# Altium project lga1700.PrjPCB (part 3 of 11)

## Sheet AUDIO - ALC897_3CH.schdoc
size 594 x 421 mm; Symbol: Sheet-Symbol_A2; Company: 嘉立创EDA; Version: V1.0; Page Size: A2; @Project Name: H610(2024/12/09); @Page Count: 36; @Update Date: 2025-10-09; @Create Date: 2025-10-09; @Schematic Name: SCHEMATIC1; @Page No: 20; @Page Name: AUDIO - ALC897_3CH; Device: Sheet-Symbol_A2; @Board Name: SCHEMATIC1; @Create Time: 10:15:41; @Update Time: 10:39:12
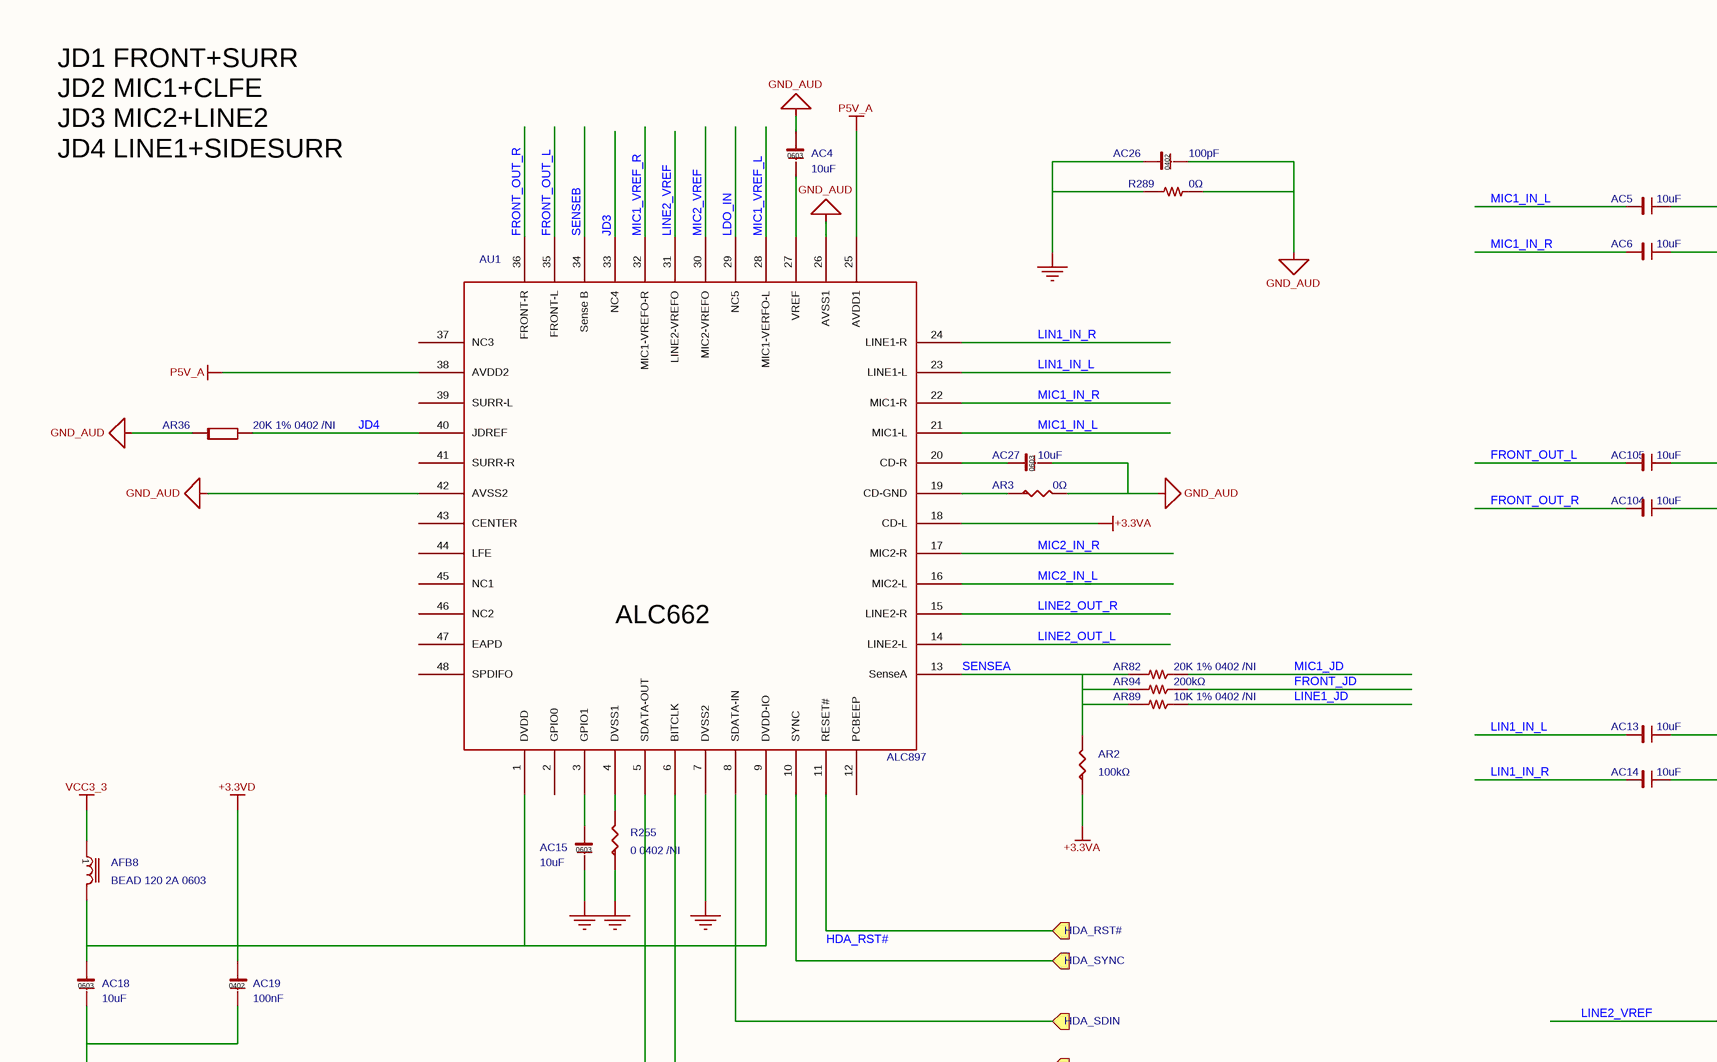
[diagram p7: AUDIO - ALC897_3CH.schdoc, top left]
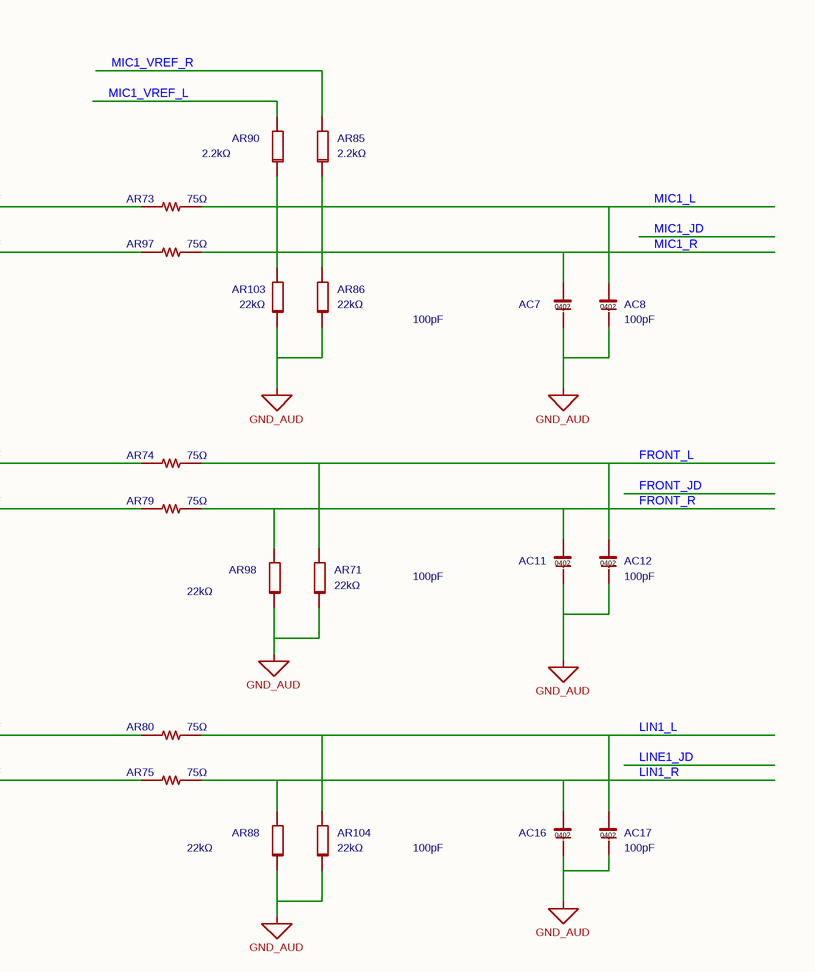
[diagram p8: AUDIO - ALC897_3CH.schdoc, top right]
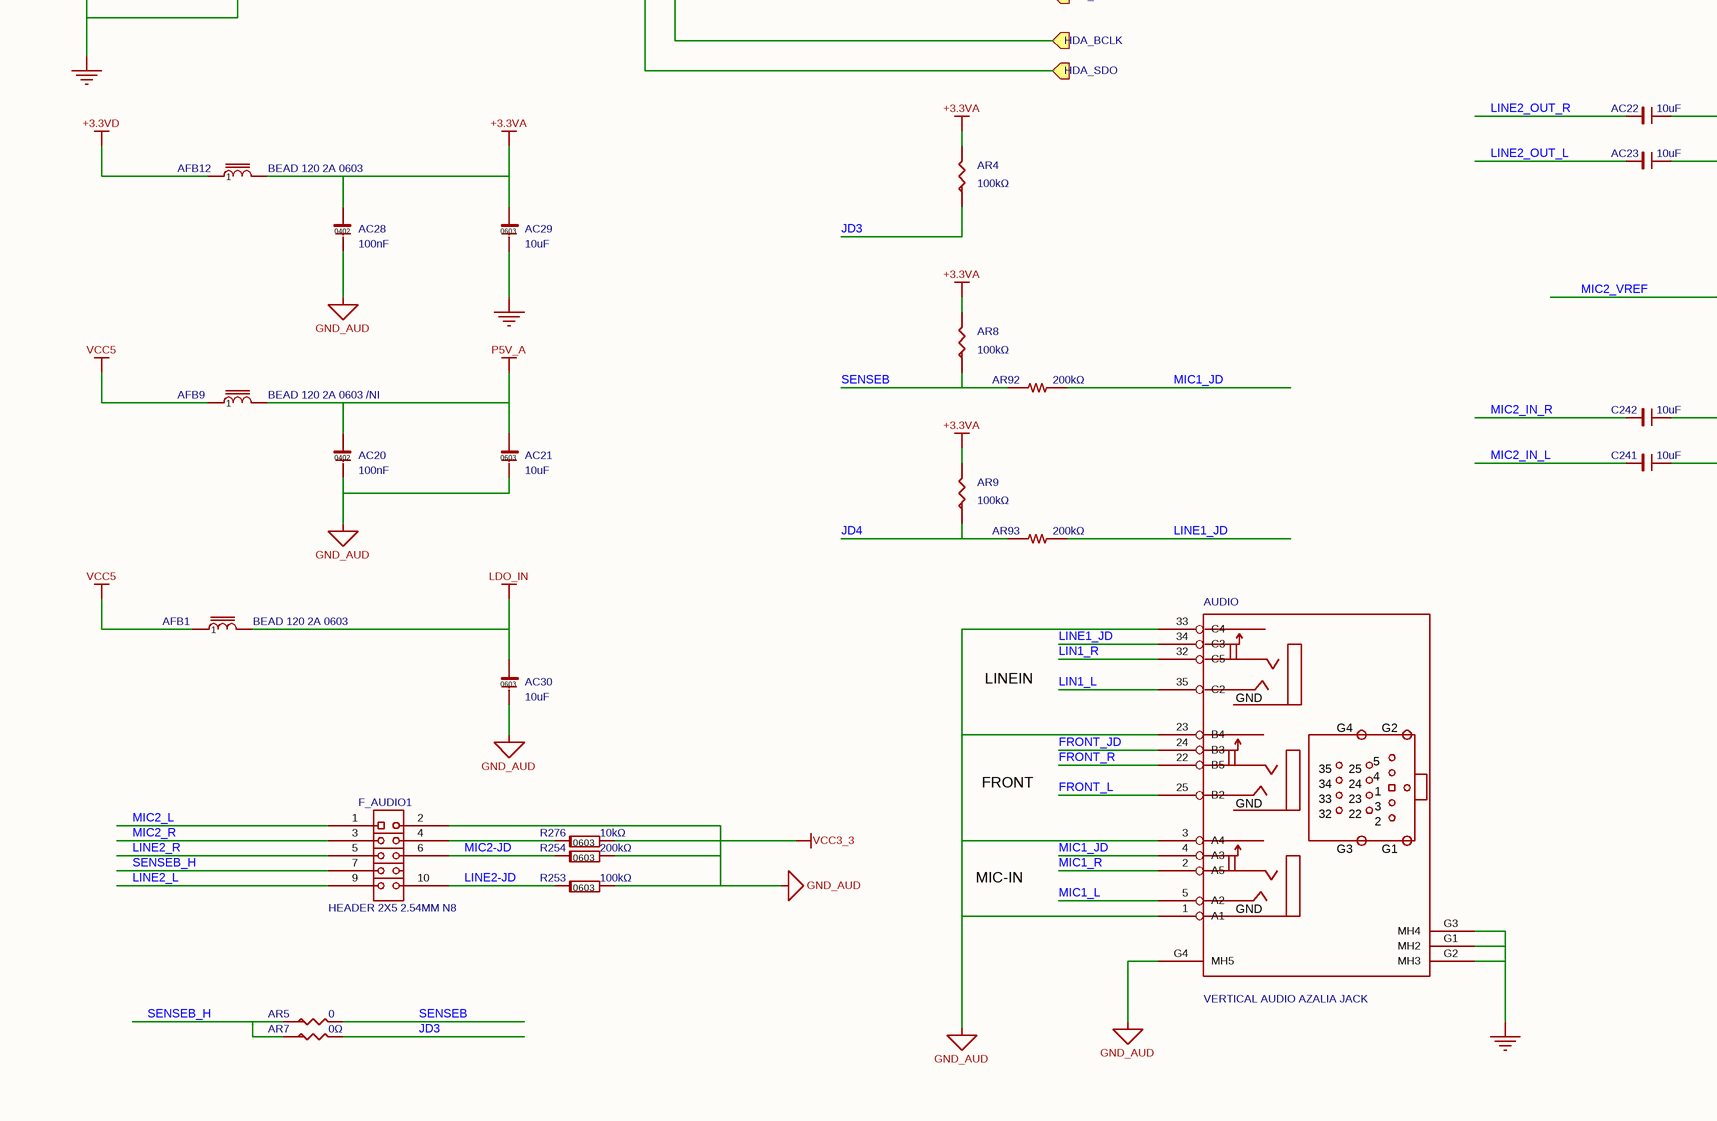
[diagram p9: AUDIO - ALC897_3CH.schdoc, bottom left]
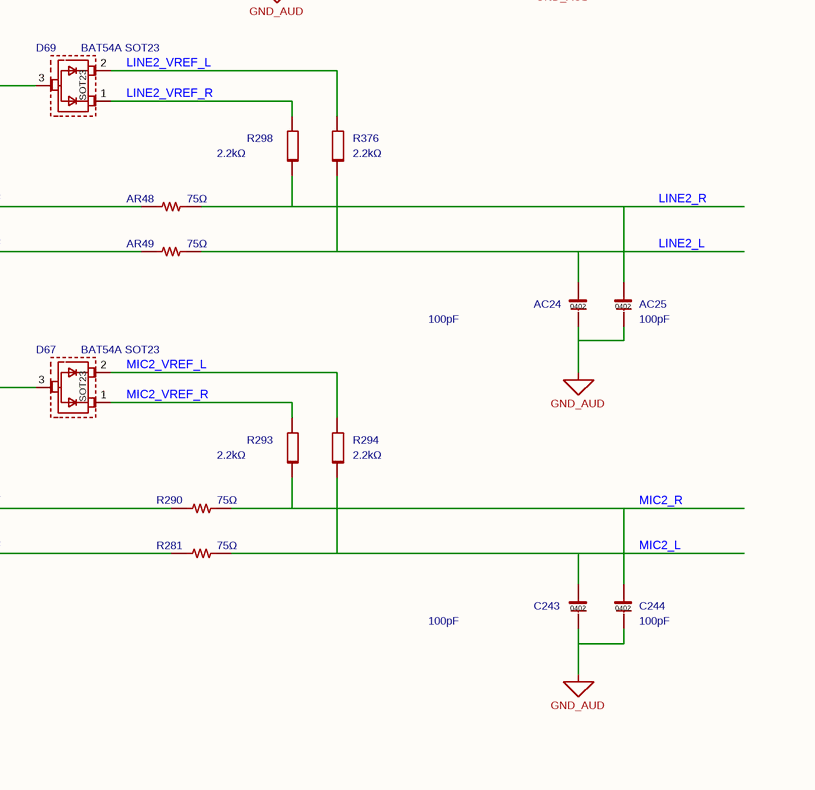
[diagram p10: AUDIO - ALC897_3CH.schdoc, bottom right]

### Parts
AC4  10uF  [C0603]
AC5  10uF  [C0603_1]
AC6  10uF  [C0603_1]
AC7  100pF  [C0402]
AC8  100pF  [C0402_1]
AC11  100pF  [C0402_1]
AC12  100pF  [C0402_1]
AC13  10uF  [C0603_1]
AC14  10uF  [C0603_1]
AC15  10uF  [C0603]
AC16  100pF  [C0402_1]
AC17  100pF  [C0402_1]
AC18  10uF  [C0603]
AC19  100nF  [C0402]
AC20  100nF  [C0402_2]
AC21  10uF  [C0603_2]
AC22  10uF  [C0603_1]
AC23  10uF  [C0603_1]
AC24  100pF  [C0402_2]
AC25  100pF  [C0402_2]
AC26  100pF  [C0402_2]
AC27  10uF  [C0603_1]
AC28  100nF  [C0402_2]
AC29  10uF  [C0603_1]
AC30  10uF  [C0603_3]
AC104  10uF  [C0603_3]
AC105  10uF  [C0603_3]
AFB1  value BEAD 120 2A 0603  [FB0603_2]  (hidden comment: FERRITE BEAD)
AFB8  value BEAD 120 2A 0603  [FB0603]  (hidden comment: FERRITE BEAD)
AFB9  value BEAD 120 2A 0603 /NI  [FB0603_1]  (hidden comment: FERRITE BEAD)
AFB12  value BEAD 120 2A 0603  [FB0603_2]  (hidden comment: FERRITE BEAD)
AR2  100kΩ  [R0402]
AR3  0Ω  [R0402_1]
AR4  100kΩ  [R0402_2]
AR5  value 0  [R0402_2]  (hidden comment: RESISTOR)
AR7  0Ω  [R0402]
AR8  100kΩ  [R0402]
AR9  100kΩ  [R0402_3]
AR36  value 20K 1% 0402 /NI  [R0402_1]  (hidden comment: R0402)
AR48  75Ω  [R0402_3]
AR49  75Ω  [R0402_3]
AR71  22kΩ  [R0402_1]
AR73  75Ω  [R0402_2]
AR74  75Ω  [R0402_3]
AR75  75Ω  [R0402_3]
AR79  75Ω  [R0402_3]
AR80  75Ω  [R0402_3]
AR82  value 20K 1% 0402 /NI  [R0402_2]  (hidden comment: 10_R_0)
AR85  2.2kΩ  [R0402_2]
AR86  22kΩ  [R0402]
AR88  22kΩ  [R0402_1]
AR89  value 10K 1% 0402 /NI  [R0402_2]  (hidden comment: 10_R_0)
AR90  2.2kΩ  [R0402_2]
AR92  200kΩ  [R0402_2]
AR93  200kΩ  [R0402_3]
AR94  200kΩ  [R0402_2]
AR97  75Ω  [R0402_2]
AR98  22kΩ  [R0402_1]
AR103  22kΩ  [R0402_2]
AR104  22kΩ  [R0402_1]
AU1  value ALC897  [LQFP48]  (hidden comment: ALC662_1)
AUDIO  value VERTICAL AUDIO AZALIA JACK  [AUDIO_V]  (hidden comment: ABA-JAK-027-K24)
C241  10uF  [C0603_1]
C242  10uF  [C0603_1]
C243  100pF  [C0402_2]
C244  100pF  [C0402_2]
D67  value BAT54A SOT23  [SOT23_124]  (hidden comment: BAT54A)
D69  value BAT54A SOT23  [SOT23_124]  (hidden comment: BAT54A)
F_AUDIO1  value HEADER 2X5 2.54MM N8  [PIN2X5_2D54_NC8]  (hidden comment: 210-82-05GB06)
R253  100kΩ  [R0402_1]
R254  200kΩ  [R0402_1]
R255  value 0 0402 /NI  [R0402]  (hidden comment: R)
R276  10kΩ  [R0402_1]
R281  75Ω  [R0402_3]
R289  0Ω  [R0603_2]
R290  75Ω  [R0402_3]
R293  2.2kΩ  [R0402]
R294  2.2kΩ  [R0402]
R298  2.2kΩ  [R0402]
R376  2.2kΩ  [R0402]

### Ports
HDA_BCLK (in), HDA_RST# (in), HDA_SDIN (in), HDA_SDO (in), HDA_SYNC (in)

### Nets
+3.3VA: AC28.1 AC29.1 AFB12.2 AR2.1 AR4.2 AR8.2 AR9.2 AU1.18(CD-L)
+3.3VD: AC18.1 AC19.1 AFB8.2 AFB12.1 AU1.1(DVDD) AU1.9(DVDD-IO)
GND: AC15.2 AC18.2 AC19.2 AC26.1 AC29.2 AU1.7(DVSS2) AUDIO.G1(MH2) AUDIO.G2(MH3) AUDIO.G3(MH4) R255.1 R289.1
GND_AUD: AC4.1 AC7.2 AC8.2 AC11.2 AC12.2 AC16.2 AC17.2 AC20.2 AC21.2 AC24.2 AC25.2 AC26.2 AC27.2 AC28.2 AC30.2 AR3.2 AR36.1 AR71.1 AR86.1 AR88.1 AR98.1 AR103.1 AR104.1 AU1.26(AVSS1) AU1.42(AVSS2) AUDIO.1(A1) AUDIO.3(A4) AUDIO.23(B4) AUDIO.33(C4) AUDIO.G4(MH5) C243.2 C244.2 F_AUDIO1.2 R253.2 R254.2 R289.2
LDO_IN: AC30.1 AFB1.2 AU1.29(NC5)
P5V_A: AC20.1 AC21.1 AFB9.2 AU1.25(AVDD1) AU1.38(AVDD2)
VCC3_3: AFB8.1 R276.2
VCC5: AFB1.1 AFB9.1
FRONT_JD: AR94.2 AUDIO.24(B3)
FRONT_L: AC12.1 AR71.2 AR74.1 AUDIO.25(B2)
FRONT_OUT_L: AC105.1 AU1.35(FRONT-L)
FRONT_OUT_R: AC104.1 AU1.36(FRONT-R)
FRONT_R: AC11.1 AR79.1 AR98.2 AUDIO.22(B5)
HDA_RST#: AU1.11(RESET#) ; port HDA_RST#
JD3: AR4.1 AR7.2 AU1.33(NC4)
JD4: AR9.1 AR36.2 AR93.1 AU1.40(JDREF)
LIN1_IN_L: AC13.1 AU1.23(LINE1-L)
LIN1_IN_R: AC14.1 AU1.24(LINE1-R)
LIN1_L: AC17.1 AR80.1 AR104.2 AUDIO.35(C2)
LIN1_R: AC16.1 AR75.1 AR88.2 AUDIO.32(C5)
LINE1_JD: AR89.2 AR93.2 AUDIO.34(C3)
LINE2-JD: F_AUDIO1.10 R253.1
LINE2_L: AC24.1 AR49.1 F_AUDIO1.9 R376.1
LINE2_OUT_L: AC23.1 AU1.14(LINE2-L)
LINE2_OUT_R: AC22.1 AU1.15(LINE2-R)
LINE2_R: AC25.1 AR48.1 F_AUDIO1.5 R298.1
LINE2_VREF: AU1.31(LINE2-VREFO) D69.3
LINE2_VREF_L: D69.2 R376.2
LINE2_VREF_R: D69.1 R298.2
MIC1_IN_L: AC5.1 AU1.21(MIC1-L)
MIC1_IN_R: AC6.1 AU1.22(MIC1-R)
MIC1_JD: AR82.2 AR92.2 AUDIO.4(A3)
MIC1_L: AC8.1 AR73.1 AR90.1 AR103.2 AUDIO.5(A2)
MIC1_R: AC7.1 AR85.1 AR86.2 AR97.1 AUDIO.2(A5)
MIC1_VREF_L: AR90.2 AU1.28(MIC1-VERFO-L)
MIC1_VREF_R: AR85.2 AU1.32(MIC1-VREFO-R)
MIC2-JD: F_AUDIO1.6 R254.1
MIC2_IN_L: AU1.16(MIC2-L) C241.1
MIC2_IN_R: AU1.17(MIC2-R) C242.1
MIC2_L: C243.1 F_AUDIO1.1 R281.1 R294.1
MIC2_R: C244.1 F_AUDIO1.3 R290.1 R293.1
MIC2_VREF: AU1.30(MIC2-VREFO) D67.3
MIC2_VREF_L: D67.2 R294.2
MIC2_VREF_R: D67.1 R293.2
SENSEA: AR2.2 AR82.1 AR89.1 AR94.1 AU1.13(SenseA)
SENSEB: AR5.2 AR8.1 AR92.1 AU1.34(Sense_B)
SENSEB_H: AR5.1 AR7.1 F_AUDIO1.7
NetAC4_2: AC4.2 AU1.27(VREF)
NetAC5_2: AC5.2 AR73.2
NetAC6_2: AC6.2 AR97.2
NetAC13_2: AC13.2 AR80.2
NetAC14_2: AC14.2 AR75.2
NetAC15_1: AC15.1 AU1.3(GPIO1)
NetAC22_2: AC22.2 AR48.2
NetAC23_2: AC23.2 AR49.2
NetAC27_1: AC27.1 AU1.20(CD-R)
NetAC104_2: AC104.2 AR79.2
NetAC105_2: AC105.2 AR74.2
NetAR3_1: AR3.1 AU1.19(CD-GND)
NetAU1_4: AU1.4(DVSS1) R255.2
NetAU1_5: AU1.5(SDATA-OUT) ; port HDA_SDO
NetAU1_6: AU1.6(BITCLK) ; port HDA_BCLK
NetAU1_8: AU1.8(SDATA-IN) ; port HDA_SDIN
NetAU1_10: AU1.10(SYNC) ; port HDA_SYNC
NetC241_2: C241.2 R281.2
NetC242_2: C242.2 R290.2
NetF_AUDIO1_4: F_AUDIO1.4 R276.1

Not connected (* = marked no-connect by the designer): AU1 2(GPIO0) 12(PCBEEP) 37(NC3) 39(SURR-L) 41(SURR-R) 43(CENTER) 44(LFE) 45(NC1) 46(NC2) 47(EAPD) 48(SPDIFO)

### Notes on the sheet
- JD1 FRONT+SURR
  JD2 MIC1+CLFE
  JD3 MIC2+LINE2
  JD4 LINE1+SIDESURR
- LINEIN
- FRONT
- MIC-IN
- 更新日期
- 2025-10-09
- 原理图
- 图页
- SCHEMATIC1
- AUDIO - ALC897_3CH
- 创建日期
- 物料编码
- 审阅
- 绘制
- H610(2024/12/09)
- 版本
- V1.0
- 尺寸
- A2
- 页
- 20
- 嘉立创EDA
- 共
- 36
- (in symbol 0402WGF1002TCE) 0603
- (in symbol 0402WGF1003TCE) 0603
- (in symbol 0402WGF2003TCE) 0603
- (in symbol ABA-JAK-027-K24) GND
- (in symbol ALC662_1) ALC662
- (in symbol BAT54A_C727124) SOT23
- (in symbol CL05A106MQ5NUNC) 0603

### Library data of the parts
AC4 AC15 AC18 = CL05A106MQ5NUNC: 容值:10uF;精度:±20%;额定电压:6.3V;材质(温度系数):X5R;; Manufacturer: SAMSUNG(三星); ModelId: 36a51122f27c49738f86b3bfa98863e0; Tolerance: ±20%; AddInBom: yes; Voltage Rated: 6.3V; ModelName: C0402_L1.0-W0.5-H0.5; ModelTransform: 39.37,19.685,0,0,0,0,0,0,0; Temperature Coefficient: X5R; Device: CL05A106MQ5NUNC; Symbol: C0603; Value: 10uF; Supplier: LCSC; Datasheet: https://atta.szlcsc.com/upload/public/pdf/source/20220823/2B02EE04F8F211D38A52DCB16EB6BEBA.pdf; FootprintName: C0603; SupplierPart: C15525; ConvertToPcb: yes; LCSC Part Name: 10uF ±20% 6.3V; JLCPCB Part Class: Basic Part; ManufacturerPart: CL05A106MQ5NUNC; Supplier Footprint: 0402
AC5 AC6 AC13 AC14 AC22 AC23 AC104 AC105 C241 C242 = CL10A106KP8NNNC: 容值:10uF;精度:±10%;额定电压:10V;材质(温度系数):X5R;; Manufacturer: SAMSUNG(三星); Symbol: C0805; ModelId: ac125912035d415993ca9572d50418b1; Tolerance: ±10%; AddInBom: yes; Voltage Rated: 10V; ModelName: C0603_L1.6-W0.8-H0.8; ModelTransform: 62.992,31.496,0,0,0,0,0,0,0; Temperature Coefficient: X5R; Device: CL10A106KP8NNNC; Value: 10uF; Supplier: LCSC; Datasheet: https://atta.szlcsc.com/upload/public/pdf/source/20160103/1457707703378.pdf; SupplierPart: C19702; ConvertToPcb: yes; LCSC Part Name: 10uF ±10% 10V; JLCPCB Part Class: Basic Part; ManufacturerPart: CL10A106KP8NNNC; Supplier Footprint: 0603
  AC5 AC6 AC13 AC14 AC22 AC23 C241 C242: FootprintName: C0603_1
  AC104 AC105: FootprintName: C0603_3
AC7 = 0402CG101J500NT: 容值:100pF;精度:±5%;额定电压:50V;材质(温度系数):C0G;; Manufacturer: FH(风华); ModelId: 36a51122f27c49738f86b3bfa98863e0; Tolerance: ±5%; AddInBom: yes; Voltage Rated: 50V; ModelName: C0402_L1.0-W0.5-H0.5; ModelTransform: 39.37,19.685,0,0,0,0,0,0,0; Temperature Coefficient: C0G; Device: 0402CG101J500NT; Symbol: C0402; Value: 100pF; Supplier: LCSC; FootprintName: C0402; SupplierPart: C1546; ConvertToPcb: yes; LCSC Part Name: 100pF ±5% 50V; JLCPCB Part Class: Basic Part; ManufacturerPart: 0402CG101J500NT; Supplier Footprint: 0402
AC8 AC11 AC12 AC16 AC17 AC24-AC26 C243 C244 = 0402CG101J500NT: 容值:100pF;精度:±5%;额定电压:50V;材质(温度系数):C0G;; Manufacturer: FH(风华); Symbol: C0402; ModelId: 36a51122f27c49738f86b3bfa98863e0; Tolerance: ±5%; AddInBom: yes; Voltage Rated: 50V; ModelName: C0402_L1.0-W0.5-H0.5; ModelTransform: 39.37,19.685,0,0,0,0,0,0,0; Temperature Coefficient: C0G; Device: 0402CG101J500NT; Value: 100pF; Supplier: LCSC; SupplierPart: C1546; ConvertToPcb: yes; LCSC Part Name: 100pF ±5% 50V; JLCPCB Part Class: Basic Part; ManufacturerPart: 0402CG101J500NT; Supplier Footprint: 0402
  AC8 AC11 AC12 AC16 AC17: FootprintName: C0402_1
  AC24-AC26 C243 C244: FootprintName: C0402_2
AC19 = CL05B104KO5NNNC: 容值:100nF;精度:±10%;额定电压:16V;材质(温度系数):X7R;; Manufacturer: SAMSUNG(三星); ModelId: 36a51122f27c49738f86b3bfa98863e0; Tolerance: ±10%; AddInBom: yes; Voltage Rated: 16V; ModelName: C0402_L1.0-W0.5-H0.5; ModelTransform: 39.37,19.685,0,0,0,0,0,0,0; Temperature Coefficient: X7R; Device: CL05B104KO5NNNC; Symbol: C0402; Value: 100nF; Supplier: LCSC; Datasheet: https://atta.szlcsc.com/upload/public/pdf/source/20160103/1457707674891.pdf; FootprintName: C0402; SupplierPart: C1525; ConvertToPcb: yes; LCSC Part Name: 100nF ±10% 16V; JLCPCB Part Class: Basic Part; ManufacturerPart: CL05B104KO5NNNC; Supplier Footprint: 0402
AC20 AC28 = CL05B104KO5NNNC: 容值:100nF;精度:±10%;额定电压:16V;材质(温度系数):X7R;; Manufacturer: SAMSUNG(三星); Symbol: C0402; ModelId: 36a51122f27c49738f86b3bfa98863e0; Tolerance: ±10%; AddInBom: yes; Voltage Rated: 16V; ModelName: C0402_L1.0-W0.5-H0.5; ModelTransform: 39.37,19.685,0,0,0,0,0,0,0; Temperature Coefficient: X7R; Device: CL05B104KO5NNNC; Value: 100nF; Supplier: LCSC; Datasheet: https://atta.szlcsc.com/upload/public/pdf/source/20160103/1457707674891.pdf; FootprintName: C0402_2; SupplierPart: C1525; ConvertToPcb: yes; LCSC Part Name: 100nF ±10% 16V; JLCPCB Part Class: Basic Part; ManufacturerPart: CL05B104KO5NNNC; Supplier Footprint: 0402
AC21 AC27 AC29 AC30 = CL05A106MQ5NUNC: 容值:10uF;精度:±20%;额定电压:6.3V;材质(温度系数):X5R;; Manufacturer: SAMSUNG(三星); Symbol: C0603; ModelId: 36a51122f27c49738f86b3bfa98863e0; Tolerance: ±20%; AddInBom: yes; Voltage Rated: 6.3V; ModelName: C0402_L1.0-W0.5-H0.5; ModelTransform: 39.37,19.685,0,0,0,0,0,0,0; Temperature Coefficient: X5R; Device: CL05A106MQ5NUNC; Value: 10uF; Supplier: LCSC; Datasheet: https://atta.szlcsc.com/upload/public/pdf/source/20220823/2B02EE04F8F211D38A52DCB16EB6BEBA.pdf; SupplierPart: C15525; ConvertToPcb: yes; LCSC Part Name: 10uF ±20% 6.3V; JLCPCB Part Class: Basic Part; ManufacturerPart: CL05A106MQ5NUNC; Supplier Footprint: 0402
  AC21: FootprintName: C0603_2
  AC27 AC29: FootprintName: C0603_1
  AC30: FootprintName: C0603_3
AFB1 AFB12 = FERRITE BEAD: Check: false; AddInBom: yes; Device: FERRITE BEAD; Symbol: FERRITE BEAD; FootprintName: FB0603_2; ConvertToPcb: yes
AFB8 = FERRITE BEAD_1: Check: false; AddInBom: yes; Device: FERRITE BEAD_1; Symbol: FERRITE BEAD; FootprintName: FB0603; ConvertToPcb: yes
AFB9 = FERRITE BEAD_2: BEAD 120 2A 0603 /NI; Check: false; AddInBom: yes; Device: FERRITE BEAD_2; Symbol: FERRITE BEAD; FootprintName: FB0603_1; ConvertToPcb: yes
AR2 AR4 AR8 AR9 = 0402WGF1003TCE: 电阻类型:厚膜电阻;阻值:100kΩ;精度:±1%;功率:62.5mW;; Manufacturer: UNI-ROYAL(厚声); Symbol: RESISTOR; ModelId: 671aefced39d4c318694bba8bd8efd39; Tolerance: ±1%; AddInBom: yes; Power(Watts): 62.5mW; ModelName: R0402_L1.0-W0.5-H0.5; ModelTransform: 39.37,19.685,0,0,0,0,0,0.0005,0; Overload Voltage (Max): 50V; Temperature Coefficient: ±100ppm/℃; Device: 0402WGF1003TCE; Value: 100kΩ; Type: 厚膜电阻; Supplier: LCSC; Datasheet: https://atta.szlcsc.com/upload/public/pdf/source/20200306/C422600_1E6D84923E4A46A82E41ADD87F860B5C.pdf; SupplierPart: C25741; ConvertToPcb: yes; LCSC Part Name: 100kΩ ±1% 62.5mW; JLCPCB Part Class: Basic Part; ManufacturerPart: 0402WGF1003TCE; Supplier Footprint: 0402; Operating Temperature Range: -55℃~+155℃
  AR2 AR8: FootprintName: R0402
  AR4: FootprintName: R0402_2
  AR9: FootprintName: R0402_3
AR3 AR7 = 0402WGF0000TCE: 电阻类型:厚膜电阻;阻值:0Ω;精度:±1%;功率:62.5mW;; Manufacturer: UNI-ROYAL(厚声); Symbol: RESISTOR; ModelId: 671aefced39d4c318694bba8bd8efd39; Tolerance: ±1%; AddInBom: yes; Power(Watts): 62.5mW; ModelName: R0402_L1.0-W0.5-H0.5; ModelTransform: 39.37,19.685,0,0,0,0,0,0.0005,0; Overload Voltage (Max): 50V; Temperature Coefficient: ±800ppm/℃; Device: 0402WGF0000TCE; Value: 0Ω; Type: 厚膜电阻; Supplier: LCSC; Datasheet: https://atta.szlcsc.com/upload/public/pdf/source/20200306/C422600_1E6D84923E4A46A82E41ADD87F860B5C.pdf; SupplierPart: C17168; ConvertToPcb: yes; LCSC Part Name: 0Ω ±1% 62.5mW; JLCPCB Part Class: Basic Part; ManufacturerPart: 0402WGF0000TCE; Supplier Footprint: 0402; Operating Temperature Range: -55℃~+155℃
  AR3: FootprintName: R0402_1
  AR7: FootprintName: R0402
AR5 = RESISTOR: 0 0402 /NI 选焊; Check: false; AddInBom: yes; Device: RESISTOR; Symbol: RESISTOR; FootprintName: R0402_2; ConvertToPcb: yes
AR36 = R0402: 20K 1% 0402 /NI; Check: false; AddInBom: yes; Device: R0402; Symbol: R0402; ConvertToPcb: yes; FootprintName: R0402_1
AR48 AR49 AR73-AR75 AR79 AR80 AR97 R281 R290 = 0402WGF750JTCE: 电阻类型:厚膜电阻;阻值:75Ω;精度:±1%;功率:62.5mW;; Manufacturer: UNI-ROYAL(厚声); Symbol: R_3; ModelId: 671aefced39d4c318694bba8bd8efd39; Tolerance: ±1%; AddInBom: yes; Power(Watts): 62.5mW; ModelName: R0402_L1.0-W0.5-H0.5; ModelTransform: 39.37,19.685,0,0,0,0,0,0.0005,0; Overload Voltage (Max): 50V; Temperature Coefficient: ±100ppm/℃; Device: 0402WGF750JTCE; Value: 75Ω; Type: 厚膜电阻; Supplier: LCSC; Datasheet: https://atta.szlcsc.com/upload/public/pdf/source/20200306/C422600_1E6D84923E4A46A82E41ADD87F860B5C.pdf; SupplierPart: C25133; ConvertToPcb: yes; LCSC Part Name: 75Ω ±1% 62.5mW; JLCPCB Part Class: Basic Part; ManufacturerPart: 0402WGF750JTCE; Supplier Footprint: 0402; Operating Temperature Range: -55℃~+155℃
  AR48 AR49 AR74 AR75 AR79 AR80 R281 R290: FootprintName: R0402_3
  AR73 AR97: FootprintName: R0402_2
AR71 AR88 AR98 AR103 AR104 = 0402WGF2202TCE: 电阻类型:厚膜电阻;阻值:22kΩ;精度:±1%;功率:62.5mW;; Manufacturer: UNI-ROYAL(厚声); Symbol: R0402; ModelId: 671aefced39d4c318694bba8bd8efd39; Tolerance: ±1%; AddInBom: yes; Power(Watts): 62.5mW; ModelName: R0402_L1.0-W0.5-H0.5; ModelTransform: 39.37,19.685,0,0,0,0,0,0.0005,0; Overload Voltage (Max): 50V; Temperature Coefficient: ±100ppm/℃; Device: 0402WGF2202TCE; Value: 22kΩ; Type: 厚膜电阻; Supplier: LCSC; Datasheet: https://atta.szlcsc.com/upload/public/pdf/source/20200306/C422600_1E6D84923E4A46A82E41ADD87F860B5C.pdf; SupplierPart: C25768; ConvertToPcb: yes; LCSC Part Name: 22kΩ ±1% 62.5mW; JLCPCB Part Class: Basic Part; ManufacturerPart: 0402WGF2202TCE; Supplier Footprint: 0402; Operating Temperature Range: -55℃~+155℃
  AR71 AR88 AR98 AR104: FootprintName: R0402_1
  AR103: FootprintName: R0402_2
AR82 = 10_R_0: Check: false; AddInBom: yes; Device: 10_R_0; Symbol: 10_R_0; FootprintName: R0402_2; ConvertToPcb: yes
AR85 AR90 = 0402WGF2201TCE: 电阻类型:厚膜电阻;阻值:2.2kΩ;精度:±1%;功率:62.5mW;; Manufacturer: UNI-ROYAL(厚声); Symbol: R0402; ModelId: 671aefced39d4c318694bba8bd8efd39; Tolerance: ±1%; AddInBom: yes; Power(Watts): 62.5mW; ModelName: R0402_L1.0-W0.5-H0.5; ModelTransform: 39.37,19.685,0,0,0,0,0,0.0005,0; Overload Voltage (Max): 50V; Temperature Coefficient: ±100ppm/℃; Device: 0402WGF2201TCE; Value: 2.2kΩ; Type: 厚膜电阻; Supplier: LCSC; Datasheet: https://atta.szlcsc.com/upload/public/pdf/source/20200306/C422600_1E6D84923E4A46A82E41ADD87F860B5C.pdf; FootprintName: R0402_2; SupplierPart: C25879; ConvertToPcb: yes; LCSC Part Name: 2.2kΩ ±1% 62.5mW; JLCPCB Part Class: Basic Part; ManufacturerPart: 0402WGF2201TCE; Supplier Footprint: 0402; Operating Temperature Range: -55℃~+155℃
AR86 = 0402WGF2202TCE: 电阻类型:厚膜电阻;阻值:22kΩ;精度:±1%;功率:62.5mW;; Manufacturer: UNI-ROYAL(厚声); ModelId: 671aefced39d4c318694bba8bd8efd39; Tolerance: ±1%; AddInBom: yes; Power(Watts): 62.5mW; ModelName: R0402_L1.0-W0.5-H0.5; ModelTransform: 39.37,19.685,0,0,0,0,0,0.0005,0; Overload Voltage (Max): 50V; Temperature Coefficient: ±100ppm/℃; Device: 0402WGF2202TCE; Symbol: R0402; Value: 22kΩ; Type: 厚膜电阻; Supplier: LCSC; Datasheet: https://atta.szlcsc.com/upload/public/pdf/source/20200306/C422600_1E6D84923E4A46A82E41ADD87F860B5C.pdf; FootprintName: R0402; SupplierPart: C25768; ConvertToPcb: yes; LCSC Part Name: 22kΩ ±1% 62.5mW; JLCPCB Part Class: Basic Part; ManufacturerPart: 0402WGF2202TCE; Supplier Footprint: 0402; Operating Temperature Range: -55℃~+155℃
AR89 = 10_R_0: Manufacturer: UNI-ROYAL(厚声); Manufacturer Part: 0402WGF1002TCE; 3D Model: 671aefced39d4c318694bba8bd8efd39; 3D Model Transform: 39.37,19.685,0,0,0,0,0,0.0005,0; Tolerance: ±1%; Power(Watts): 62.5mW; Overload Voltage (Max): 50V; Temperature Coefficient: ±100ppm/℃; Check: false; AddInBom: yes; Device: 10_R_0; Symbol: 10_R_0; LCSC Part Name: 10kΩ ±1% 62.5mW 厚膜电阻; Supplier Part: C25744; Supplier Footprint: 0402; JLCPCB Part Class: Basic Part; Datasheet: https://atta.szlcsc.com/upload/public/pdf/source/20200306/C422600_1E6D84923E4A46A82E41ADD87F860B5C.pdf; Supplier: LCSC; Type: 厚膜电阻; Operating Temperature Range: -55℃~+155℃; FootprintName: R0402_2; ConvertToPcb: yes
AR92-AR94 = 0402WGF2003TCE: 电阻类型:厚膜电阻;阻值:200kΩ;精度:±1%;功率:62.5mW;; Manufacturer: UNI-ROYAL(厚声); Symbol: 10_R_0; ModelId: 671aefced39d4c318694bba8bd8efd39; Tolerance: ±1%; AddInBom: yes; Power(Watts): 62.5mW; ModelName: R0402_L1.0-W0.5-H0.5; ModelTransform: 39.37,19.685,0,0,0,0,0,0.0005,0; Overload Voltage (Max): 50V; Temperature Coefficient: ±100ppm/℃; Device: 0402WGF2003TCE; Value: 200kΩ; Type: 厚膜电阻; Supplier: LCSC; Datasheet: https://atta.szlcsc.com/upload/public/pdf/source/20200306/C422600_1E6D84923E4A46A82E41ADD87F860B5C.pdf; SupplierPart: C25764; ConvertToPcb: yes; LCSC Part Name: 200kΩ ±1% 62.5mW; JLCPCB Part Class: Basic Part; ManufacturerPart: 0402WGF2003TCE; Supplier Footprint: 0402; Operating Temperature Range: -55℃~+155℃
  AR92 AR94: FootprintName: R0402_2
  AR93: FootprintName: R0402_3
AU1 = ALC662_1: Check: false; AddInBom: yes; Device: ALC662_1; Symbol: ALC662_1; FootprintName: LQFP48; ConvertToPcb: yes
AUDIO = ABA-JAK-027-K24: 连接器类型:3.5mm耳机座;额定电流:-;额定电压:-;工作温度范围:-25℃~+85℃;; Manufacturer: LOTES(嘉澤端子); Symbol: PHONEJACK OPEN SW_0; AddInBom: yes; ModelId: 9c52c713033f4ae592d105a413021057; ModelName: AUDIO-TH_ABA-JAK-027-K11; ModelTransform: 574.802,966.53358,0,0,0,0,-0.005,-90.549,-165.354; Device: ABA-JAK-027-K24; LCSC Part Name: 3.5mm耳机座; SupplierPart: C962118; ManufacturerPart: ABA-JAK-027-K24; Supplier Footprint: 插件; JLCPCB Part Class: 扩展库; Datasheet: https://atta.szlcsc.com/upload/public/pdf/source/20201125/C962118_19A1289A010465396137572C9F53A68A.pdf; Supplier: LCSC; ConvertToPcb: yes; FootprintName: AUDIO_V; Connector Type: 3.5mm耳机座; Current Rating (Max): -; Voltage Rating (Max): -; Operating Temperature Range: -25℃~+85℃
D67 D69 = BAT54A_C727124: 二极管配置:1对共阳极;正向压降(Vf):1V@100mA;直流反向耐压(Vr):30V;平均整流电流(Io):200mA;; Manufacturer: TWGMC(台湾迪嘉); AddInBom: yes; ModelId: c62791f0466c4ae2a892c056b845b0ca; ModelName: SOT-23-3P_L2.9-W1.3-H1.0-LS2.4-P0.95; ModelTransform: 98.425,114.173,0,180,0,0,0.0005,-0.0005,0; Diode Configuration: 1对共阳极; Reverse Voltage (Vr): 30V; Average Rectified Current (Io): 200mA; Reverse Leakage Current (Ir): 2uA@25V; Device: BAT54A_C727124; Symbol: BAT54A; LCSC Part Name: 电压:30V 电流:200mA; SupplierPart: C727124; ManufacturerPart: BAT54A; Supplier Footprint: SOT-23; JLCPCB Part Class: Extended Part; Datasheet: https://atta.szlcsc.com/upload/public/pdf/source/20200827/C727124_5D482B6B1AEFE8F49931502BEAC75010.pdf; Supplier: LCSC; ConvertToPcb: yes; FootprintName: SOT23_124; Forward Voltage (Vf@If): 1V@100mA
F_AUDIO1 = 210-82-05GB06: 插针结构:2x5P;间距:2.54mm;行距:2.54mm;圆针/方针:方针;安装类型:直插;排数:双排;总PIN位数:10P;额定电流:3A;额定电压:-;配合针长度:6.1mm;塑高:2.5mm;端接针长度:3mm;触头材质:黄铜;触头镀层:-;工作温度范围:-40℃~+105℃;颜色:黑色;; Manufacturer: PINREX(频锐科技); Symbol: HEADER_2; AddInBom: yes; ModelId: 62da575dbf8d4f378d360e32527d3dcb; ModelName: HDR-TH_10P-P2.54_210-82-05GB06; ModelTransform: 490.157,196.85,0,0,0,0,0,0,-118.11; Pin Structure: 2x5P; Pitch: 2.54mm; Circluar Pins/Square Pins: 方针; Current Rating (Max): 3A; Device: 210-82-05GB06; LCSC Part Name: 间距:2.54mm 2x5P 直插 方针 黑金; SupplierPart: C390687; ManufacturerPart: 210-82-05GB06; Supplier Footprint: 插件,P=2.54mm; JLCPCB Part Class: 扩展库; Datasheet: https://atta.szlcsc.com/upload/public/pdf/source/20190506/C390687_1FA441D5BA312DF4E77D37F916E9E386.pdf; Supplier: LCSC; ConvertToPcb: yes; FootprintName: PIN2X5_2D54_NC8; Row Spacing: 2.54mm; Mounting Type: 直插; Number of Rows: 双排; Number of Pins: 10P; Voltage Rating (Max): -; Length of Mating Pin: 6.1mm; Insulation Height: 2.5mm; Length of End Connection Pin: 3mm; Contact Material: 黄铜; Contact Plating: -; Operating Temperature Range: -40℃~+105℃; Color: 黑色
R253 = 0402WGF1003TCE: 电阻类型:厚膜电阻;阻值:100kΩ;精度:±1%;功率:62.5mW;; Manufacturer: UNI-ROYAL(厚声); Symbol: R0603; ModelId: 671aefced39d4c318694bba8bd8efd39; Tolerance: ±1%; AddInBom: yes; Power(Watts): 62.5mW; ModelName: R0402_L1.0-W0.5-H0.5; ModelTransform: 39.37,19.685,0,0,0,0,0,0.0005,0; Overload Voltage (Max): 50V; Temperature Coefficient: ±100ppm/℃; Device: 0402WGF1003TCE; Value: 100kΩ; Type: 厚膜电阻; Supplier: LCSC; Datasheet: https://atta.szlcsc.com/upload/public/pdf/source/20200306/C422600_1E6D84923E4A46A82E41ADD87F860B5C.pdf; FootprintName: R0402_1; SupplierPart: C25741; ConvertToPcb: yes; LCSC Part Name: 100kΩ ±1% 62.5mW; JLCPCB Part Class: Basic Part; ManufacturerPart: 0402WGF1003TCE; Supplier Footprint: 0402; Operating Temperature Range: -55℃~+155℃
R254 = 0402WGF2003TCE: 电阻类型:厚膜电阻;阻值:200kΩ;精度:±1%;功率:62.5mW;; Manufacturer: UNI-ROYAL(厚声); Symbol: R0603; ModelId: 671aefced39d4c318694bba8bd8efd39; Tolerance: ±1%; AddInBom: yes; Power(Watts): 62.5mW; ModelName: R0402_L1.0-W0.5-H0.5; ModelTransform: 39.37,19.685,0,0,0,0,0,0.0005,0; Overload Voltage (Max): 50V; Temperature Coefficient: ±100ppm/℃; Device: 0402WGF2003TCE; Value: 200kΩ; Type: 厚膜电阻; Supplier: LCSC; Datasheet: https://atta.szlcsc.com/upload/public/pdf/source/20200306/C422600_1E6D84923E4A46A82E41ADD87F860B5C.pdf; FootprintName: R0402_1; SupplierPart: C25764; ConvertToPcb: yes; LCSC Part Name: 200kΩ ±1% 62.5mW; JLCPCB Part Class: Basic Part; ManufacturerPart: 0402WGF2003TCE; Supplier Footprint: 0402; Operating Temperature Range: -55℃~+155℃
R255 = R: Check: false; AddInBom: yes; Device: R; Symbol: R; FootprintName: R0402; ConvertToPcb: yes
R276 = 0402WGF1002TCE: 电阻类型:厚膜电阻;阻值:10kΩ;精度:±1%;功率:62.5mW;; Manufacturer: UNI-ROYAL(厚声); Symbol: R0603; ModelId: 671aefced39d4c318694bba8bd8efd39; Tolerance: ±1%; AddInBom: yes; Power(Watts): 62.5mW; ModelName: R0402_L1.0-W0.5-H0.5; ModelTransform: 39.37,19.685,0,0,0,0,0,0.0005,0; Overload Voltage (Max): 50V; Temperature Coefficient: ±100ppm/℃; Device: 0402WGF1002TCE; Value: 10kΩ; Type: 厚膜电阻; Supplier: LCSC; Datasheet: https://atta.szlcsc.com/upload/public/pdf/source/20200306/C422600_1E6D84923E4A46A82E41ADD87F860B5C.pdf; FootprintName: R0402_1; SupplierPart: C25744; ConvertToPcb: yes; LCSC Part Name: 10kΩ ±1% 62.5mW; JLCPCB Part Class: Basic Part; ManufacturerPart: 0402WGF1002TCE; Supplier Footprint: 0402; Operating Temperature Range: -55℃~+155℃
R289 = 0603WAF0000T5E: 电阻类型:厚膜电阻;阻值:0Ω;精度:±1%;功率:100mW;; Manufacturer: UNI-ROYAL(厚声); Symbol: 10K; Tolerance: ±1%; ModelId: fc143cca1e79419f9cd78b61e9279f08; AddInBom: yes; Power(Watts): 100mW; ModelName: R0603; ModelTransform: 31.8897,63.7794,0,90,0,0,0,0,0; Overload Voltage (Max): 75V; Device: 0603WAF0000T5E; Value: 0Ω; Type: 厚膜电阻; Supplier: LCSC; Datasheet: https://atta.szlcsc.com/upload/public/pdf/source/20200306/C422600_1E6D84923E4A46A82E41ADD87F860B5C.pdf; FootprintName: R0603_2; SupplierPart: C21189; ConvertToPcb: yes; LCSC Part Name: 0Ω ±1% 100mW; JLCPCB Part Class: Basic Part; ManufacturerPart: 0603WAF0000T5E; Supplier Footprint: 0603; Operating Temperature Range: -55℃~+155℃
R293 R294 R298 R376 = 0402WGF2201TCE: 电阻类型:厚膜电阻;阻值:2.2kΩ;精度:±1%;功率:62.5mW;; Manufacturer: UNI-ROYAL(厚声); ModelId: 671aefced39d4c318694bba8bd8efd39; Tolerance: ±1%; AddInBom: yes; Power(Watts): 62.5mW; ModelName: R0402_L1.0-W0.5-H0.5; ModelTransform: 39.37,19.685,0,0,0,0,0,0.0005,0; Overload Voltage (Max): 50V; Temperature Coefficient: ±100ppm/℃; Device: 0402WGF2201TCE; Symbol: R0402; Value: 2.2kΩ; Type: 厚膜电阻; Supplier: LCSC; Datasheet: https://atta.szlcsc.com/upload/public/pdf/source/20200306/C422600_1E6D84923E4A46A82E41ADD87F860B5C.pdf; FootprintName: R0402; SupplierPart: C25879; ConvertToPcb: yes; LCSC Part Name: 2.2kΩ ±1% 62.5mW; JLCPCB Part Class: Basic Part; ManufacturerPart: 0402WGF2201TCE; Supplier Footprint: 0402; Operating Temperature Range: -55℃~+155℃

## Sheet COM.schdoc
size 297 x 210 mm; Symbol: Sheet-Symbol_A4; Company: 嘉立创EDA; Version: V1.0; Page Size: A4; @Project Name: 【全网首发】X86电脑主板_copy; @Page Count: 19; @Update Date: 2025-10-09; @Create Date: 2025-10-09; @Schematic Name: SCHEMATIC1_1; @Page No: 0; @Page Name: COM; Device: Sheet-Symbol_A4_1
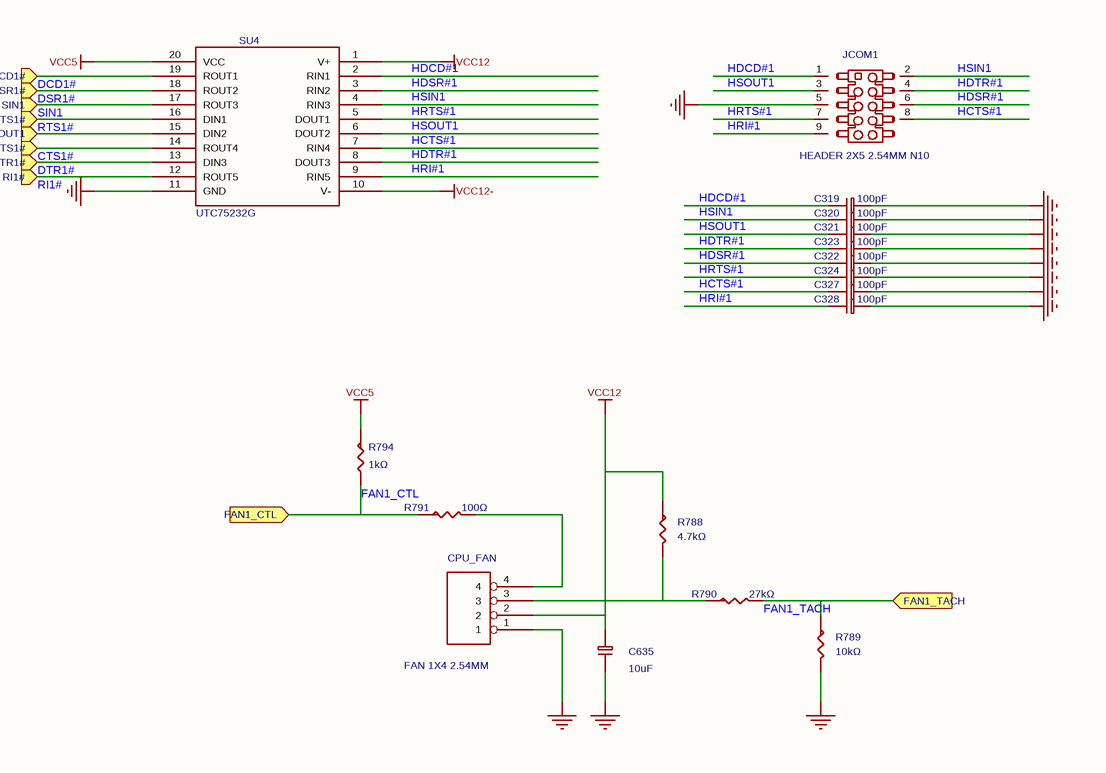
[diagram p11: COM.schdoc]

### Parts
C319  100pF  [C0402_2]
C320  100pF  [C0402]
C321  100pF  [C0402]
C322  100pF  [C0402_2]
C323  100pF  [C0402]
C324  100pF  [C0402]
C327  100pF  [C0402]
C328  100pF  [C0402]
C635  10uF  [C0805]
CPU_FAN  value FAN 1X4 2.54MM  [FAN4P]  (hidden comment: HF1004E)
JCOM1  value HEADER 2X5 2.54MM N10  [PIN2X5_2D54_NC10]  (hidden comment: 210-92-05GB02)
R788  4.7kΩ  [R0402_1]
R789  10kΩ  [R0402_3]
R790  27kΩ  [R0402_1]
R791  100Ω  [R0402_1]
R794  1kΩ  [R0402_3]
SU4  value UTC75232G  [TSSOP20]  (hidden comment: DS14185_0)

### Ports
CTS1# (in), DCD1# (in), DSR1# (in), DTR1# (in), FAN1_CTL (in), FAN1_TACH (in), RI1# (in), RTS1# (in), SIN1 (in), SOUT1 (in)

### Nets
GND: C319.2 C320.2 C321.2 C322.2 C323.2 C324.2 C327.2 C328.2 C635.1 CPU_FAN.1 JCOM1.5 R789.2 SU4.11(GND)
VCC5: R794.1 SU4.20(VCC)
VCC12: C635.2 CPU_FAN.2 R788.1 SU4.1(V+)
VCC12-: SU4.10(V-)
CTS1#: SU4.14(ROUT4) ; port CTS1#
DCD1#: SU4.19(ROUT1) ; port DCD1#
DSR1#: SU4.18(ROUT2) ; port DSR1#
DTR1#: SU4.13(DIN3) ; port DTR1#
FAN1_CTL: R791.1 R794.2 ; port FAN1_CTL
FAN1_TACH: R789.1 R790.2 ; port FAN1_TACH
HCTS#1: C327.1 JCOM1.8 SU4.7(RIN4)
HDCD#1: C319.1 JCOM1.1 SU4.2(RIN1)
HDSR#1: C322.1 JCOM1.6 SU4.3(RIN2)
HDTR#1: C323.1 JCOM1.4 SU4.8(DOUT3)
HRI#1: C328.1 JCOM1.9 SU4.9(RIN5)
HRTS#1: C324.1 JCOM1.7 SU4.5(DOUT1)
HSIN1: C320.1 JCOM1.2 SU4.4(RIN3)
HSOUT1: C321.1 JCOM1.3 SU4.6(DOUT2)
RI1#: SU4.12(ROUT5) ; port RI1#
RTS1#: SU4.16(DIN1) ; port RTS1#
SIN1: SU4.17(ROUT3) ; port SIN1
NetCPU_FAN_3: CPU_FAN.3 R788.2 R790.1
NetCPU_FAN_4: CPU_FAN.4 R791.2
NetSU3_58: SU4.15(DIN2) ; port SOUT1

### Notes on the sheet
- 更新日期
- 2025-10-09
- 原理图
- 图页
- SCHEMATIC1_1
- COM
- 创建日期
- 物料编码
- 审阅
- 绘制
- 【全网首发】X86电脑主板_copy
- 版本
- V1.0
- 尺寸
- A4
- 页
- 0
- 嘉立创EDA
- 共
- 19

### Library data of the parts
C319-C324 C327 C328 = 0402CG101J500NT: 容值:100pF;精度:±5%;额定电压:50V;材质(温度系数):C0G;; Manufacturer: FH(风华); Symbol: C-0603_4; ModelId: 36a51122f27c49738f86b3bfa98863e0; Tolerance: ±5%; AddInBom: yes; Voltage Rated: 50V; ModelName: C0402_L1.0-W0.5-H0.5; ModelTransform: 39.37,19.685,0,0,0,0,0,0,0; Temperature Coefficient: C0G; Device: 0402CG101J500NT; Value: 100pF; Supplier: LCSC; SupplierPart: C1546; ConvertToPcb: yes; LCSC Part Name: 100pF ±5% 50V; JLCPCB Part Class: Basic Part; ManufacturerPart: 0402CG101J500NT; Supplier Footprint: 0402
  C319 C322: FootprintName: C0402_2
  C320 C321 C323 C324 C327 C328: FootprintName: C0402
C635 = CL21A106KOQNNNE: 容值:10uF;精度:±10%;额定电压:16V;材质(温度系数):X5R;; Manufacturer: SAMSUNG(三星); Symbol: CAP NP_31; ModelId: 1ba041120af144c991958decab20d241; Tolerance: ±10%; AddInBom: yes; Voltage Rated: 16V; ModelName: C0805_L2.0-W1.3-H1.3; ModelTransform: 78.74,51.181,0,0,0,0,0,0.0005,0; Temperature Coefficient: X5R; Device: CL21A106KOQNNNE; Value: 10uF; Supplier: LCSC; Datasheet: https://atta.szlcsc.com/upload/public/pdf/source/20160103/1457707694240.pdf; FootprintName: C0805; SupplierPart: C1713; ConvertToPcb: yes; LCSC Part Name: 10uF ±10% 16V; JLCPCB Part Class: Extended Part; ManufacturerPart: CL21A106KOQNNNE; Supplier Footprint: 0805
CPU_FAN = HF1004E: 插针结构:1x4P;间距:2.54mm;安装方式:直插;参考系列:-;总PIN数:4P;排数:1;每排PIN数:4;行距:-;额定电流:-;工作温度范围:-;; Manufacturer: FOXCONN(富士康); Symbol: HEADER 4_0; AddInBom: yes; ModelId: ec34a5bd49134116a835459c2f382328; ModelName: CONN-TH_4P-P2.54_HF1004E; ModelTransform: 400.039,225.1964,0,0,0,0,0,12.008,-137.795; Pins Structure: 1x4P; Pitch: 2.54mm; Number of PINs Per Row: 4; Device: HF1004E; JLCPCB Part Class: Extended Part; LCSC Part Name: 1x4P 间距:2.54mm 直插; SupplierPart: C2761402; ManufacturerPart: HF1004E; Supplier Footprint: 插件,P=2.54mm; Datasheet: https://atta.szlcsc.com/upload/public/pdf/source/20210329/C2761402_8B7F6B32F26E3706188E3A95E69D0044.pdf; Supplier: LCSC; ConvertToPcb: yes; FootprintName: FAN4P; Mounting Style: 直插; Reference Series: -; Number of Pins: 4P; Number of Rows: 1; Row Spacing: -; Current Rating (Max): -; Operating Temperature Range: -
JCOM1 = 210-92-05GB02: 插针结构:2x5P;间距:2.54mm;行距:2.54mm;圆针/方针:方针;安装类型:直插;排数:双排;总PIN位数:10P;额定电流:3A;额定电压:-;配合针长度:6.1mm;塑高:2.5mm;端接针长度:3mm;触头材质:黄铜;触头镀层:-;工作温度范围:-40℃~+105℃;颜色:黑色;; Manufacturer: PINREX(频锐科技); Symbol: PIN HEADER 2X7 2_0.54; AddInBom: yes; ModelId: 4a96607ad93f48408c2a0a6543c48f7d; ModelName: HDR-TH_9P-P2.54-M-LI-2X5P; ModelTransform: 490.157,196.85,0,0,0,0,0,0,-118.11; Pin Structure: 2x5P; Pitch: 2.54mm; Circluar Pins/Square Pins: 方针; Current Rating (Max): 3A; Device: 210-92-05GB02; JLCPCB Part Class: Extended Part; LCSC Part Name: 间距:2.54mm 2x5P 直插 方针 黑金; SupplierPart: C390689; ManufacturerPart: 210-92-05GB02; Supplier Footprint: 插件,P=2.54mm; Datasheet: https://atta.szlcsc.com/upload/public/pdf/source/20190506/C390689_DC56D71BCD7C484749B58F96D2D2D6C5.pdf; Supplier: LCSC; ConvertToPcb: yes; FootprintName: PIN2X5_2D54_NC10; Row Spacing: 2.54mm; Mounting Type: 直插; Number of Rows: 双排; Number of Pins: 10P; Voltage Rating (Max): -; Length of Mating Pin: 6.1mm; Insulation Height: 2.5mm; Length of End Connection Pin: 3mm; Contact Material: 黄铜; Contact Plating: -; Operating Temperature Range: -40℃~+105℃; Color: 黑色
R788 = 0402WGF4701TCE: 电阻类型:厚膜电阻;阻值:4.7kΩ;精度:±1%;功率:62.5mW;; Manufacturer: UNI-ROYAL(厚声); Symbol: RESISTOR; ModelId: 671aefced39d4c318694bba8bd8efd39; Tolerance: ±1%; AddInBom: yes; Power(Watts): 62.5mW; ModelName: R0402_L1.0-W0.5-H0.5; ModelTransform: 39.37,19.685,0,0,0,0,0,0.0005,0; Overload Voltage (Max): 50V; Temperature Coefficient: ±100ppm/℃; Device: 0402WGF4701TCE; Value: 4.7kΩ; Type: 厚膜电阻; Supplier: LCSC; Datasheet: https://atta.szlcsc.com/upload/public/pdf/source/20200306/C422600_1E6D84923E4A46A82E41ADD87F860B5C.pdf; FootprintName: R0402_1; SupplierPart: C25900; ConvertToPcb: yes; LCSC Part Name: 4.7kΩ ±1% 62.5mW; JLCPCB Part Class: Basic Part; ManufacturerPart: 0402WGF4701TCE; Supplier Footprint: 0402; Operating Temperature Range: -55℃~+155℃
R789 = 0402WGF1002TCE: 电阻类型:厚膜电阻;阻值:10kΩ;精度:±1%;功率:62.5mW;; Manufacturer: UNI-ROYAL(厚声); Symbol: RESISTOR; ModelId: 671aefced39d4c318694bba8bd8efd39; Tolerance: ±1%; AddInBom: yes; Power(Watts): 62.5mW; ModelName: R0402_L1.0-W0.5-H0.5; ModelTransform: 39.37,19.685,0,0,0,0,0,0.0005,0; Overload Voltage (Max): 50V; Temperature Coefficient: ±100ppm/℃; Device: 0402WGF1002TCE; Value: 10kΩ; Type: 厚膜电阻; Supplier: LCSC; Datasheet: https://atta.szlcsc.com/upload/public/pdf/source/20200306/C422600_1E6D84923E4A46A82E41ADD87F860B5C.pdf; FootprintName: R0402_3; SupplierPart: C25744; ConvertToPcb: yes; LCSC Part Name: 10kΩ ±1% 62.5mW; JLCPCB Part Class: Basic Part; ManufacturerPart: 0402WGF1002TCE; Supplier Footprint: 0402; Operating Temperature Range: -55℃~+155℃
R790 = 0402WGF2702TCE: 电阻类型:厚膜电阻;阻值:27kΩ;精度:±1%;功率:62.5mW;; Manufacturer: UNI-ROYAL(厚声); Symbol: RESISTOR; ModelId: 671aefced39d4c318694bba8bd8efd39; Tolerance: ±1%; AddInBom: yes; Power(Watts): 62.5mW; ModelName: R0402_L1.0-W0.5-H0.5; ModelTransform: 39.37,19.685,0,0,0,0,0,0.0005,0; Overload Voltage (Max): 50V; Temperature Coefficient: ±100ppm/℃; Device: 0402WGF2702TCE; Value: 27kΩ; Type: 厚膜电阻; Supplier: LCSC; Datasheet: https://atta.szlcsc.com/upload/public/pdf/source/20200306/C422600_1E6D84923E4A46A82E41ADD87F860B5C.pdf; FootprintName: R0402_1; SupplierPart: C25771; ConvertToPcb: yes; LCSC Part Name: 27kΩ ±1% 62.5mW; JLCPCB Part Class: Basic Part; ManufacturerPart: 0402WGF2702TCE; Supplier Footprint: 0402; Operating Temperature Range: -55℃~+155℃
R791 = 0402WGF1000TCE: 电阻类型:厚膜电阻;阻值:100Ω;精度:±1%;功率:62.5mW;; Manufacturer: UNI-ROYAL(厚声); Symbol: RESISTOR; ModelId: 671aefced39d4c318694bba8bd8efd39; Tolerance: ±1%; AddInBom: yes; Power(Watts): 62.5mW; ModelName: R0402_L1.0-W0.5-H0.5; ModelTransform: 39.37,19.685,0,0,0,0,0,0.0005,0; Overload Voltage (Max): 50V; Temperature Coefficient: ±200ppm/℃; Device: 0402WGF1000TCE; Value: 100Ω; Type: 厚膜电阻; Supplier: LCSC; Datasheet: https://atta.szlcsc.com/upload/public/pdf/source/20200306/C422600_1E6D84923E4A46A82E41ADD87F860B5C.pdf; FootprintName: R0402_1; SupplierPart: C25076; ConvertToPcb: yes; LCSC Part Name: 100Ω ±1% 62.5mW; JLCPCB Part Class: Basic Part; ManufacturerPart: 0402WGF1000TCE; Supplier Footprint: 0402; Operating Temperature Range: -55℃~+155℃
R794 = 0402WGF1001TCE: 电阻类型:厚膜电阻;阻值:1kΩ;精度:±1%;功率:62.5mW;; Manufacturer: UNI-ROYAL(厚声); Symbol: RESISTOR; ModelId: 671aefced39d4c318694bba8bd8efd39; Tolerance: ±1%; AddInBom: yes; Power(Watts): 62.5mW; ModelName: R0402_L1.0-W0.5-H0.5; ModelTransform: 39.37,19.685,0,0,0,0,0,0.0005,0; Overload Voltage (Max): 50V; Temperature Coefficient: ±100ppm/℃; Device: 0402WGF1001TCE; Value: 1kΩ; Type: 厚膜电阻; Supplier: LCSC; Datasheet: https://atta.szlcsc.com/upload/public/pdf/source/20200306/C422600_1E6D84923E4A46A82E41ADD87F860B5C.pdf; FootprintName: R0402_3; SupplierPart: C11702; ConvertToPcb: yes; LCSC Part Name: 1kΩ ±1% 62.5mW; JLCPCB Part Class: Basic Part; ManufacturerPart: 0402WGF1001TCE; Supplier Footprint: 0402; Operating Temperature Range: -55℃~+155℃
SU4 = DS14185_0: Check: false; AddInBom: yes; Device: DS14185_0; Symbol: DS14185_0; FootprintName: TSSOP20; ConvertToPcb: yes

## Sheet CPU_PWR - +VCCCORE_1_3.schdoc
size 420 x 298 mm; Symbol: Sheet-Symbol_A3; Company: 嘉立创EDA; Version: V1.0; Page Size: A3; @Project Name: H610(2024/12/09); @Page Count: 36; @Update Date: 2026-10-20; @Create Date: 2026-10-20; @Schematic Name: SCHEMATIC1; @Page No: 27; @Page Name: CPU_PWR - +VCCCORE_1/3; Device: Sheet-Symbol_A3; @Board Name: SCHEMATIC1; @Create Time: 10:15:42; @Update Time: 10:18:20
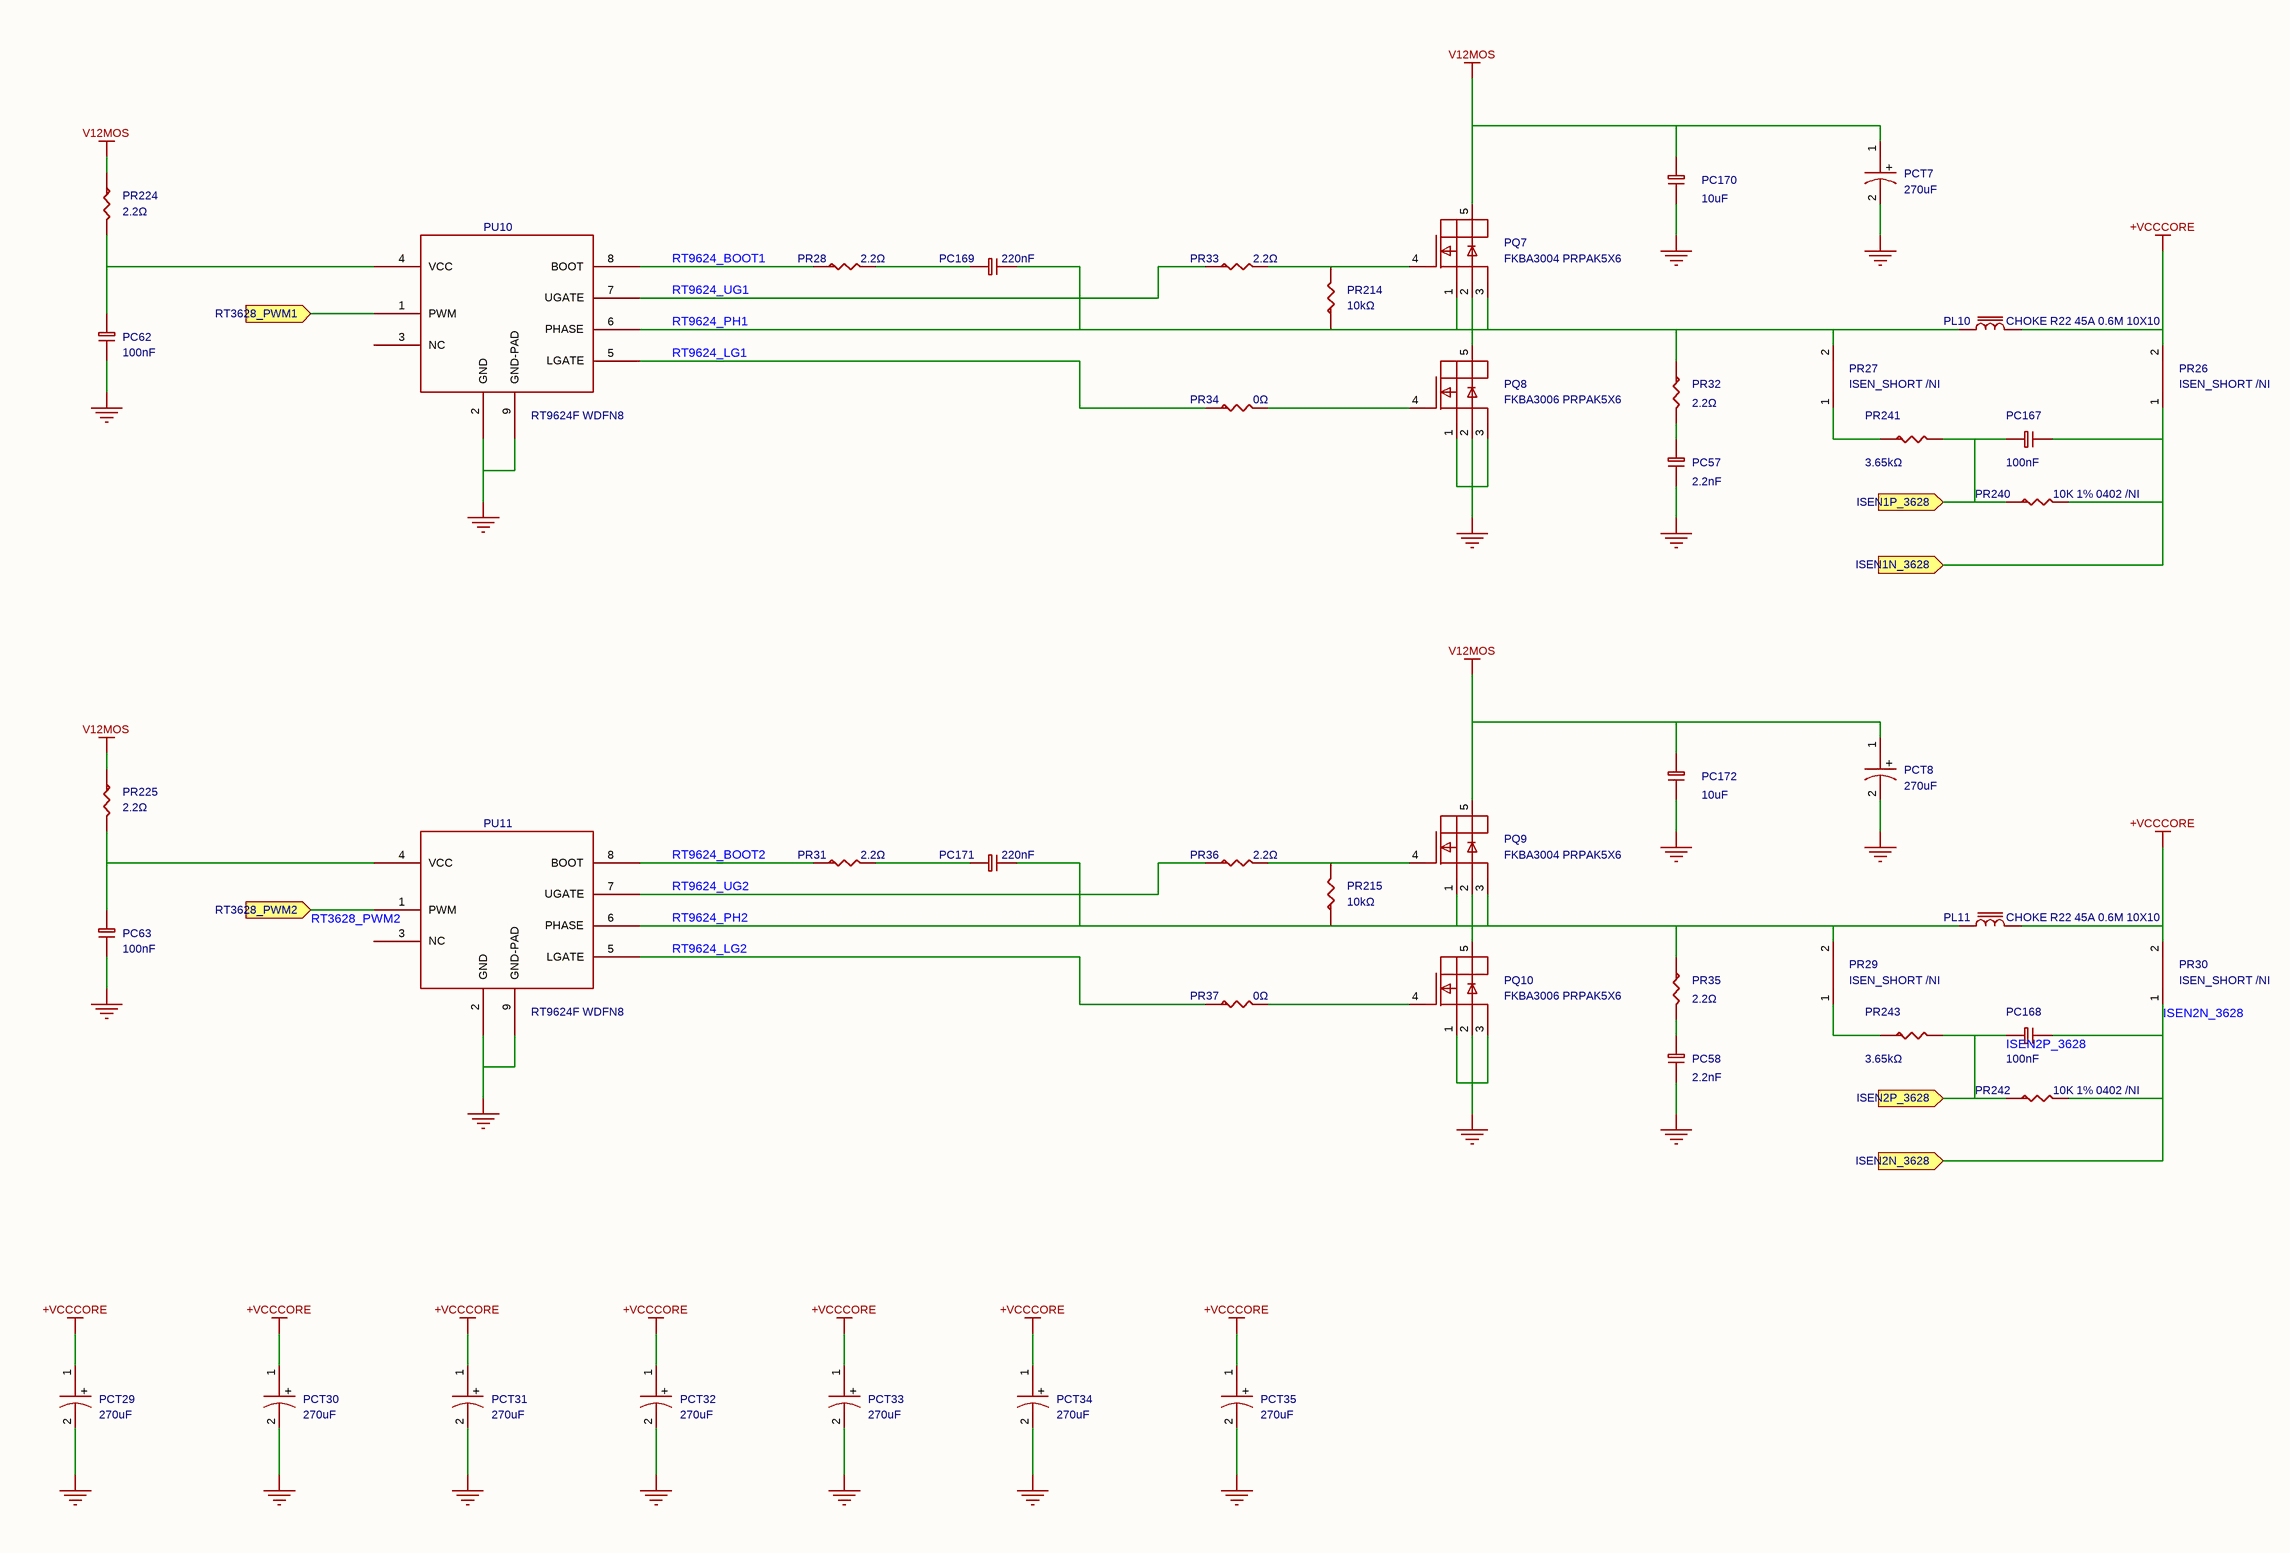
[diagram p12: CPU_PWR - +VCCCORE_1_3.schdoc]

### Parts
PC57  2.2nF  [C0402_2]
PC58  2.2nF  [C0402_2]
PC62  100nF  [C0402]
PC63  100nF  [C0402]
PC167  100nF  [C0402_3]
PC168  100nF  [C0402_3]
PC169  220nF  [C0402_3]
PC170  10uF  [C0805]
PC171  220nF  [C0402_3]
PC172  10uF  [C0805]
PCT7  270uF  [EC1P25C_2]
PCT8  270uF  [EC1P25C_2]
PCT29  270uF  [EC1P25C_2]
PCT30  270uF  [EC1P25C_2]
PCT31  270uF  [EC1P25C_2]
PCT32  270uF  [EC1P25C_2]
PCT33  270uF  [EC1P25C_2]
PCT34  270uF  [EC1P25C_2]
PCT35  270uF  [EC1P25C_2]
PL10  value CHOKE R22 45A 0.6M 10X10  [MAGIC R22]  (hidden comment: L_L70-P50-H70)
PL11  value CHOKE R22 45A 0.6M 10X10  [MAGIC R22]  (hidden comment: L_L70-P50-H70)
PQ7  value FKBA3004 PRPAK5X6  [PRPAK5X6_1]  (hidden comment: PK616BA)
PQ8  value FKBA3006 PRPAK5X6  [PRPAK5X6]  (hidden comment: PK616BA)
PQ9  value FKBA3004 PRPAK5X6  [PRPAK5X6_1]  (hidden comment: PK616BA)
PQ10  value FKBA3006 PRPAK5X6  [PRPAK5X6]  (hidden comment: PK616BA)
PR26  value ISEN_SHORT /NI  [ISEN_SHORTNI]  (hidden comment: R_0)
PR27  value ISEN_SHORT /NI  [ISEN_SHORTNI]  (hidden comment: R_0)
PR28  2.2Ω  [R0603_2]
PR29  value ISEN_SHORT /NI  [ISEN_SHORTNI]  (hidden comment: R_0)
PR30  value ISEN_SHORT /NI  [ISEN_SHORTNI]  (hidden comment: R_0)
PR31  2.2Ω  [R0603_2]
PR32  2.2Ω  [R0603_3]
PR33  2.2Ω  [R0603_3]
PR34  0Ω  [R0603_3]
PR35  2.2Ω  [R0603_3]
PR36  2.2Ω  [R0603_3]
PR37  0Ω  [R0603_3]
PR214  10kΩ  [R0402_1]
PR215  10kΩ  [R0402_1]
PR224  2.2Ω  [R0603]
PR225  2.2Ω  [R0603]
PR240  value 10K 1% 0402 /NI  [R0402_2]  (hidden comment: R-0603)
PR241  3.65kΩ  [R0402]
PR242  value 10K 1% 0402 /NI  [R0402_1]  (hidden comment: R-0603)
PR243  3.65kΩ  [R0402_3]
PU10  value RT9624F WDFN8  [DFN8_3X3MM-GND]  (hidden comment: RT9624FGQW)
PU11  value RT9624F WDFN8  [DFN8_3X3MM-GND]  (hidden comment: RT9624FGQW)

### Ports
ISEN1N_3628 (in), ISEN1P_3628 (in), ISEN2N_3628 (in), ISEN2P_3628 (in), RT3628_PWM1 (in), RT3628_PWM2 (in)

### Nets
+VCCCORE: PCT29.1 PCT30.1 PCT31.1 PCT32.1 PCT33.1 PCT34.1 PCT35.1 PL10.2 PL11.2 PR26.2 PR30.2
GND: PC57.2 PC58.2 PC62.2 PC63.2 PC170.1 PC172.1 PCT7.2 PCT8.2 PCT29.2 PCT30.2 PCT31.2 PCT32.2 PCT33.2 PCT34.2 PCT35.2 PQ8.1(SOURCE1) PQ8.2(SOURCE2) PQ8.3(SOURCE3) PQ10.1(SOURCE1) PQ10.2(SOURCE2) PQ10.3(SOURCE3) PU10.2(GND) PU10.9(GND-PAD) PU11.2(GND) PU11.9(GND-PAD)
V12MOS: PC170.2 PC172.2 PCT7.1 PCT8.1 PQ7.5(DRAIN1) PQ9.5(DRAIN1) PR224.1 PR225.1
ISEN2N_3628: PC168.2 PR30.1 PR242.2 ; port ISEN2N_3628
ISEN2P_3628: PC168.1 PR242.1 PR243.2 ; port ISEN2P_3628
RT3628_PWM2: PU11.1(PWM) ; port RT3628_PWM2
RT9624_BOOT1: PR28.1 PU10.8(BOOT)
RT9624_BOOT2: PR31.1 PU11.8(BOOT)
RT9624_LG1: PR34.1 PU10.5(LGATE)
RT9624_LG2: PR37.1 PU11.5(LGATE)
RT9624_PH1: PC169.2 PL10.1 PQ7.1(SOURCE1) PQ7.2(SOURCE2) PQ7.3(SOURCE3) PQ8.5(DRAIN1) PR27.2 PR32.1 PR214.1 PU10.6(PHASE)
RT9624_PH2: PC171.2 PL11.1 PQ9.1(SOURCE1) PQ9.2(SOURCE2) PQ9.3(SOURCE3) PQ10.5(DRAIN1) PR29.2 PR35.1 PR215.1 PU11.6(PHASE)
RT9624_UG1: PR33.1 PU10.7(UGATE)
RT9624_UG2: PR36.1 PU11.7(UGATE)
NetPC57_1: PC57.1 PR32.2
NetPC58_1: PC58.1 PR35.2
NetPC62_1: PC62.1 PR224.2 PU10.4(VCC)
NetPC63_1: PC63.1 PR225.2 PU11.4(VCC)
NetPC167_1: PC167.1 PR240.1 PR241.2 ; port ISEN1P_3628
NetPC167_2: PC167.2 PR26.1 PR240.2 ; port ISEN1N_3628
NetPC169_1: PC169.1 PR28.2
NetPC171_1: PC171.1 PR31.2
NetPQ7_4: PQ7.4(GATE) PR33.2 PR214.2
NetPQ8_4: PQ8.4(GATE) PR34.2
NetPQ9_4: PQ9.4(GATE) PR36.2 PR215.2
NetPQ10_4: PQ10.4(GATE) PR37.2
NetPR27_1: PR27.1 PR241.1
NetPR29_1: PR29.1 PR243.1
NetPU10_1: PU10.1(PWM) ; port RT3628_PWM1

Not connected (* = marked no-connect by the designer): PU10 3(NC); PU11 3(NC)

### Notes on the sheet
- 更新日期
- 2026-10-20
- 原理图
- 图页
- SCHEMATIC1
- CPU_PWR - +VCCCORE_1/3
- 创建日期
- 物料编码
- 审阅
- 绘制
- H610(2024/12/09)
- 版本
- V1.0
- 尺寸
- A3
- 页
- 27
- 嘉立创EDA
- 共
- 36
- (in symbol 160AREC271M0609) +

### Library data of the parts
PC57 PC58 = CC0402KRX7R9BB222: 容值:2.2nF;精度:±10%;额定电压:50V;材质(温度系数):X7R;; Manufacturer: YAGEO(国巨); Symbol: CAP; PCB Footprint: C0402; Tolerance: ±10%; ModelId: 36a51122f27c49738f86b3bfa98863e0; AddInBom: yes; Voltage Rated: 50V; ModelName: C0402_L1.0-W0.5-H0.5; ModelTransform: 39.37,19.685,0,0,0,0,0,0,0; Temperature Coefficient: X7R; Device: CC0402KRX7R9BB222; Value: 2.2nF; Supplier: LCSC; Datasheet: https://atta.szlcsc.com/upload/public/pdf/source/20170505/1493957848374.pdf; FootprintName: C0402_2; SupplierPart: C106861; ConvertToPcb: yes; LCSC Part Name: 2.2nF ±10% 50V; JLCPCB Part Class: Extended Part; ManufacturerPart: CC0402KRX7R9BB222; Supplier Footprint: 0402
PC62 PC63 = CL05B104KO5NNNC: 容值:100nF;精度:±10%;额定电压:16V;材质(温度系数):X7R;; Manufacturer: SAMSUNG(三星); Symbol: CAP; Tolerance: ±10%; ModelId: 36a51122f27c49738f86b3bfa98863e0; AddInBom: yes; Voltage Rated: 16V; ModelName: C0402_L1.0-W0.5-H0.5; ModelTransform: 39.37,19.685,0,0,0,0,0,0,0; Temperature Coefficient: X7R; Device: CL05B104KO5NNNC; PCB Footprint: C0402; Value: 100nF; Supplier: LCSC; Datasheet: https://atta.szlcsc.com/upload/public/pdf/source/20160103/1457707674891.pdf; FootprintName: C0402; SupplierPart: C1525; ConvertToPcb: yes; LCSC Part Name: 100nF ±10% 16V; JLCPCB Part Class: Basic Part; ManufacturerPart: CL05B104KO5NNNC; Supplier Footprint: 0402
PC167 PC168 = CL05B104KO5NNNC: 容值:100nF;精度:±10%;额定电压:16V;材质(温度系数):X7R;; Manufacturer: SAMSUNG(三星); Symbol: CAP; PCB Footprint: C0402; Tolerance: ±10%; ModelId: 36a51122f27c49738f86b3bfa98863e0; AddInBom: yes; Voltage Rated: 16V; ModelName: C0402_L1.0-W0.5-H0.5; ModelTransform: 39.37,19.685,0,0,0,0,0,0,0; Temperature Coefficient: X7R; Device: CL05B104KO5NNNC; Value: 100nF; Supplier: LCSC; Datasheet: https://atta.szlcsc.com/upload/public/pdf/source/20160103/1457707674891.pdf; FootprintName: C0402_3; SupplierPart: C1525; ConvertToPcb: yes; LCSC Part Name: 100nF ±10% 16V; JLCPCB Part Class: Basic Part; ManufacturerPart: CL05B104KO5NNNC; Supplier Footprint: 0402
PC169 PC171 = CL05B224KO5NNNC: 容值:220nF;精度:±10%;额定电压:16V;材质(温度系数):X7R;; Manufacturer: SAMSUNG(三星); Symbol: CAP; PCB Footprint: C0402; Tolerance: ±10%; ModelId: 36a51122f27c49738f86b3bfa98863e0; AddInBom: yes; Voltage Rated: 16V; ModelName: C0402_L1.0-W0.5-H0.5; ModelTransform: 39.37,19.685,0,0,0,0,0,0,0; Temperature Coefficient: X7R; Device: CL05B224KO5NNNC; Value: 220nF; Supplier: LCSC; Datasheet: https://atta.szlcsc.com/upload/public/pdf/source/20160103/1457707689724.pdf; FootprintName: C0402_3; SupplierPart: C16772; ConvertToPcb: yes; LCSC Part Name: 220nF ±10% 16V; JLCPCB Part Class: Basic Part; ManufacturerPart: CL05B224KO5NNNC; Supplier Footprint: 0402
PC170 PC172 = CL21A106KOQNNNE: as C635 on sheet COM; Device: CL21A106KOQNNNE; Value: 10uF; Supplier: LCSC; Datasheet: https://atta.szlcsc.com/upload/public/pdf/source/20160103/1457707694240.pdf; FootprintName: C0805; SupplierPart: C1713; ConvertToPcb: yes; LCSC Part Name: 10uF ±10% 16V; JLCPCB Part Class: Extended Part; ManufacturerPart: CL21A106KOQNNNE; Supplier Footprint: 0805
PCT7 PCT8 PCT29-PCT35 = 160AREC271M0609: 容值:270uF;精度:±20%;额定电压:16V;纹波电流:3.8A@100kHz;等效串联电阻:15mΩ@100kHz~300kHz;类型:-;; Manufacturer: APAQ(钰邦); Symbol: CAPACITOR POL_0; AddInBom: yes; ModelId: 0a4db4bf24b443b3be4905be97ff10c5; ModelName: CAP-TH_BD6.3-P2.50-D1.0-FD; ModelTransform: 248.4247,247.99777,0,0,0,0,0,0,-137.795; Tolerance: ±20%; Rated Voltage: 16V; φD: 6.3mm; L: 9mm; Lifetime @ Temp: 2000hrs@105℃; Device: 160AREC271M0609; Value: 270uF; LCSC Part Name: 270uF ±20% 16V; SupplierPart: C176312; ManufacturerPart: 160AREC271M0609; Supplier Footprint: 插件,D6.3xL9mm; JLCPCB Part Class: Extended Part; Datasheet: https://atta.szlcsc.com/upload/public/pdf/source/20180420/C176312_A6CC051F3F5535015096354530D22B11.pdf; Supplier: LCSC; ConvertToPcb: yes; FootprintName: EC1P25C_2; Ripple Current: 3.8A@100kHz; Equivalent Series Resistance(ESR): 15mΩ@100kHz~300kHz; Type: -; Lead Spacing: 2.5mm; Operating Temperature: -55℃~+105℃
PL10 = L_L70-P50-H70_1: R22 一体成型直插电感; Check: false; Add into BOM: yes; Device: L_L70-P50-H70_1; Symbol: L_L70-P50-H70; FootprintName: MAGIC R22; ConvertToPcb: yes
PL11 = L_L70-P50-H70_1: Check: false; AddInBom: yes; Device: L_L70-P50-H70_1; Symbol: L_L70-P50-H70; FootprintName: MAGIC R22; ConvertToPcb: yes
PQ7-PQ10 = PK616BA: 类型:1个N沟道;漏源电压(Vdss):30V;连续漏极电流(Id):50A;功率(Pd):31W;导通电阻(RDS(on)@Vgs,Id):9.5mΩ@4.5V,13A;阈值电压(Vgs(th)@Id):3V@250uA;; Manufacturer: NIKO-SEM(尼克森); Symbol: MOS-N_SO8_1; AddInBom: yes; ModelId: 178189b27e7544aca50c111426555358; ModelName: PDFN-8_L4.9-W5.8-H1.0-P1.27; ModelTransform: 200.787,240.157,0,0,0,0,-0.097,0,0; Drain Source Voltage (Vdss): 30V; Continuous Drain Current (Id): 50A; Power Dissipation (Pd): 31W; Device: PK616BA; LCSC Part Name: 1个N沟道 耐压:30V 电流:50A; SupplierPart: C133608; ManufacturerPart: PK616BA; Supplier Footprint: PDFN-8(5.8x4.9); JLCPCB Part Class: Extended Part; Datasheet: https://atta.szlcsc.com/upload/public/pdf/source/20170930/C133608_1506736454344997453.pdf; Supplier: LCSC; ConvertToPcb: yes; Type: 1个N沟道; Drain Source On Resistance (RDS(on)@Vgs,Id): 9.5mΩ@4.5V,13A; Gate Threshold Voltage (Vgs(th)@Id): 3V@250uA
  PQ7 PQ9: FootprintName: PRPAK5X6_1
  PQ8 PQ10: FootprintName: PRPAK5X6
PR26 PR27 PR29 PR30 = R_0: Check: false; AddInBom: yes; Device: R_0; Symbol: R_0; FootprintName: ISEN_SHORTNI; ConvertToPcb: yes
PR28 PR31-PR33 PR35 PR36 = 0603WAF220KT5E: 电阻类型:厚膜电阻;阻值:2.2Ω;精度:±1%;功率:100mW;; Manufacturer: UNI-ROYAL(厚声); Symbol: R_1; ModelId: fc143cca1e79419f9cd78b61e9279f08; Tolerance: ±1%; AddInBom: yes; Power(Watts): 100mW; ModelName: R0603; ModelTransform: 31.8897,63.7794,0,90,0,0,0,0,0; Overload Voltage (Max): 75V; Temperature Coefficient: ±400ppm/℃; Device: 0603WAF220KT5E; Value: 2.2Ω; Type: 厚膜电阻; Supplier: LCSC; Datasheet: https://atta.szlcsc.com/upload/public/pdf/source/20200306/C422600_1E6D84923E4A46A82E41ADD87F860B5C.pdf; SupplierPart: C22939; ConvertToPcb: yes; LCSC Part Name: 2.2Ω ±1% 100mW; JLCPCB Part Class: Basic Part; ManufacturerPart: 0603WAF220KT5E; Supplier Footprint: 0603; Operating Temperature Range: -55℃~+155℃
  PR28 PR31: FootprintName: R0603_2
  PR32 PR33 PR35 PR36: FootprintName: R0603_3
PR34 PR37 = 0603WAF0000T5E: 电阻类型:厚膜电阻;阻值:0Ω;精度:±1%;功率:100mW;; Manufacturer: UNI-ROYAL(厚声); Symbol: R_1; ModelId: fc143cca1e79419f9cd78b61e9279f08; Tolerance: ±1%; AddInBom: yes; Power(Watts): 100mW; ModelName: R0603; ModelTransform: 31.8897,63.7794,0,90,0,0,0,0,0; Overload Voltage (Max): 75V; Device: 0603WAF0000T5E; Value: 0Ω; Type: 厚膜电阻; Supplier: LCSC; Datasheet: https://atta.szlcsc.com/upload/public/pdf/source/20200306/C422600_1E6D84923E4A46A82E41ADD87F860B5C.pdf; FootprintName: R0603_3; SupplierPart: C21189; ConvertToPcb: yes; LCSC Part Name: 0Ω ±1% 100mW; JLCPCB Part Class: Basic Part; ManufacturerPart: 0603WAF0000T5E; Supplier Footprint: 0603; Operating Temperature Range: -55℃~+155℃
PR214 PR215 = 0402WGF1002TCE: 电阻类型:厚膜电阻;阻值:10kΩ;精度:±1%;功率:62.5mW;; Manufacturer: UNI-ROYAL(厚声); Symbol: R-0603; ModelId: 671aefced39d4c318694bba8bd8efd39; Tolerance: ±1%; AddInBom: yes; Power(Watts): 62.5mW; ModelName: R0402_L1.0-W0.5-H0.5; ModelTransform: 39.37,19.685,0,0,0,0,0,0.0005,0; Overload Voltage (Max): 50V; Temperature Coefficient: ±100ppm/℃; Device: 0402WGF1002TCE; Value: 10kΩ; Type: 厚膜电阻; Supplier: LCSC; Datasheet: https://atta.szlcsc.com/upload/public/pdf/source/20200306/C422600_1E6D84923E4A46A82E41ADD87F860B5C.pdf; FootprintName: R0402_1; SupplierPart: C25744; ConvertToPcb: yes; LCSC Part Name: 10kΩ ±1% 62.5mW; JLCPCB Part Class: Basic Part; ManufacturerPart: 0402WGF1002TCE; Supplier Footprint: 0402; Operating Temperature Range: -55℃~+155℃
PR224 PR225 = 0603WAF220KT5E: 电阻类型:厚膜电阻;阻值:2.2Ω;精度:±1%;功率:100mW;; Manufacturer: UNI-ROYAL(厚声); Symbol: R_1; ModelId: fc143cca1e79419f9cd78b61e9279f08; Tolerance: ±1%; AddInBom: yes; Power(Watts): 100mW; ModelTransform: 31.8897,63.7794,0,90,0,0,0,0,0; Overload Voltage (Max): 75V; Temperature Coefficient: ±400ppm/℃; Device: 0603WAF220KT5E; Value: 2.2Ω; Type: 厚膜电阻; Supplier: LCSC; Datasheet: https://atta.szlcsc.com/upload/public/pdf/source/20200306/C422600_1E6D84923E4A46A82E41ADD87F860B5C.pdf; FootprintName: R0603; SupplierPart: C22939; ModelName: R0603; ConvertToPcb: yes; LCSC Part Name: 2.2Ω ±1% 100mW; JLCPCB Part Class: Basic Part; ManufacturerPart: 0603WAF220KT5E; Supplier Footprint: 0603; Operating Temperature Range: -55℃~+155℃
PR240 = R-0603_2: Manufacturer: YAGEO(国巨); Manufacturer Part: RC0402FR-0710KL; 3D Model: 671aefced39d4c318694bba8bd8efd39; 3D Model Transform: 39.37,19.685,0,0,0,0,0,0.0005,0; Tolerance: ±1%; Power(Watts): 62.5mW; Overload Voltage (Max): 50V; Temperature Coefficient: ±100ppm/℃; AddInBom: yes; Device: R-0603_2; Symbol: R-0603; LCSC Part Name: 厚膜电阻 10kΩ ±1% 62.5mW; Supplier Part: C60490; Supplier Footprint: 0402; JLCPCB Part Class: Extended Part; Datasheet: https://atta.szlcsc.com/upload/public/pdf/source/20170925/C131467_1506321478108990263.pdf; Supplier: LCSC; Type: 厚膜电阻; Operating Temperature Range: -55℃~+155℃; FootprintName: R0402_2; ConvertToPcb: yes
PR241 PR243 = ERJ2RKF3651X: 电阻类型:厚膜电阻;阻值:3.65kΩ;精度:±1%;功率:100mW;最大工作电压:100V;温度系数:±100ppm/℃;; Manufacturer: PANASONIC(松下); Symbol: R-0603; AddInBom: yes; ModelId: 671aefced39d4c318694bba8bd8efd39; ModelName: R0402_L1.0-W0.5-H0.5; ModelTransform: 39.37,19.685,0,0,0,0,0,0.0005,0; Tolerance: ±1%; Power(Watts): 100mW; Overload Voltage (Max): 100V; Device: ERJ2RKF3651X; Value: 3.65kΩ; LCSC Part Name: 3.65kΩ ±1% 100mW 厚膜电阻; SupplierPart: C416527; ManufacturerPart: ERJ2RKF3651X; Supplier Footprint: 0402; JLCPCB Part Class: Extended Part; Datasheet: https://atta.szlcsc.com/upload/public/pdf/source/20190902/C416527_C4564A8D72F3E2A9CDC3D7769B95121D.pdf; Supplier: LCSC; ConvertToPcb: yes; Type: 厚膜电阻; Temperature Coefficient: ±100ppm/℃; Operating Temperature Range: -55℃~+155℃
  PR241: FootprintName: R0402
  PR243: FootprintName: R0402_3
PR242 = R-0603_3: Manufacturer: YAGEO(国巨); Manufacturer Part: RC0402FR-0710KL; 3D Model: 671aefced39d4c318694bba8bd8efd39; 3D Model Transform: 39.37,19.685,0,0,0,0,0,0.0005,0; Tolerance: ±1%; Power(Watts): 62.5mW; Overload Voltage (Max): 50V; Temperature Coefficient: ±100ppm/℃; AddInBom: yes; Device: R-0603_3; Symbol: R-0603; LCSC Part Name: 厚膜电阻 10kΩ ±1% 62.5mW; Supplier Part: C60490; Supplier Footprint: 0402; JLCPCB Part Class: Extended Part; Datasheet: https://atta.szlcsc.com/upload/public/pdf/source/20170925/C131467_1506321478108990263.pdf; Supplier: LCSC; Type: 厚膜电阻; Operating Temperature Range: -55℃~+155℃; FootprintName: R0402_1; ConvertToPcb: yes
PU10 PU11 = RT9624FGQW: Manufacturer: RICHTEK(立锜); Symbol: RT9624F_1; AddInBom: yes; ModelId: 87cbd0851a6d45bba9a717edfc43b2c9; ModelName: TDFN-8_L3.0-W3.0-P0.65-BL-EP2.3; ModelTransform: 118.11,118.8974,0,0,0,0,0,0,0; Device: RT9624FGQW; LCSC Part Name: Single Phase Synchronous Rectified Buck MOSFET Driver; SupplierPart: C3020454; ManufacturerPart: RT9624FGQW; Supplier Footprint: TDFN-8-EP(3x3); JLCPCB Part Class: Extended Part; Datasheet: https://atta.szlcsc.com/upload/public/pdf/source/20220608/64F557171D909C63F38446B0F2BC2FB2.pdf; Supplier: LCSC; ConvertToPcb: yes; FootprintName: DFN8_3X3MM-GND